# EAGLE design MEB-LV (EAGLE 9.6.2)
Assembly variants: Manufacturing, Customer

## Sheet 1 of 3: Mitochondrik
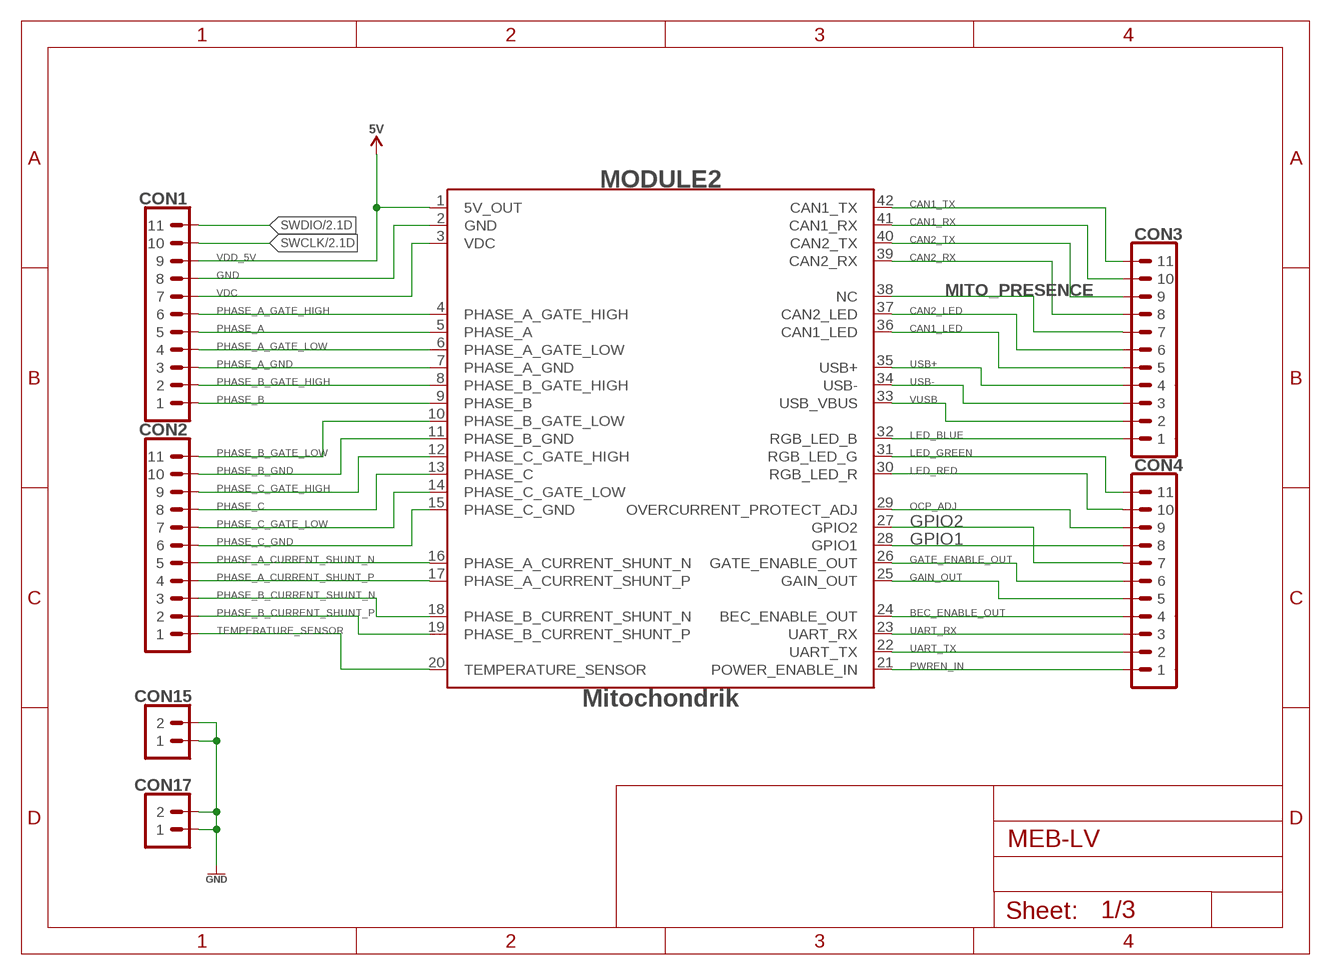
[diagram p0: schematic, sheet 1]

### Parts
CON1  PINHEAD_1X11-2.54_STRAIGHT_MALE  [1X11-PTH-2.54]
CON2  PINHEAD_1X11-2.54_STRAIGHT_MALE  [1X11-PTH-2.54]
CON3  PINHEAD_1X11-2.54_STRAIGHT_MALE  [1X11-PTH-2.54]
CON4  PINHEAD_1X11-2.54_STRAIGHT_MALE  [1X11-PTH-2.54]
CON15  PINHEAD_1X02-2.54  [1X02-PTH-2.54]
CON17  PINHEAD_1X02-2.54  [1X02-PTH-2.54]
MODULE2  MITOCHONDRIK  [MITOCHONDRIK]

### Nets
BEC_ENABLE_OUT: CON4.4 MODULE2.24(BEC_ENABLE_OUT) ; also sheet 2
CAN1_LED: CON3.5 MODULE2.36(CAN1_LED) ; also sheet 2
CAN1_RX: CON3.10 MODULE2.41(CAN1_RX) ; also sheet 2
CAN1_TX: CON3.11 MODULE2.42(CAN1_TX) ; also sheet 2
CAN2_LED: CON3.6 MODULE2.37(CAN2_LED) ; also sheet 2
CAN2_RX: CON3.8 MODULE2.39(CAN2_RX) ; also sheet 2
CAN2_TX: CON3.9 MODULE2.40(CAN2_TX) ; also sheet 2
GAIN_OUT: CON4.5 MODULE2.25(GAIN_OUT) ; also sheet 2
GATE_ENABLE_OUT: CON4.6 MODULE2.26(GATE_ENABLE_OUT) ; also sheet 2
GND: CON1.8 CON15.1 CON15.2 CON17.1 CON17.2 MODULE2.2(GND) ; also sheet 2,3
GPIO1: CON4.8 MODULE2.28(GPIO1) ; also sheet 2
GPIO2: CON4.7 MODULE2.27(GPIO2) ; also sheet 2
LED_BLUE: CON3.1 MODULE2.32(RGB_LED_B) ; also sheet 2
LED_GREEN: CON4.11 MODULE2.31(RGB_LED_G) ; also sheet 2
LED_RED: CON4.10 MODULE2.30(RGB_LED_R) ; also sheet 2
MITO_PRESENCE: CON3.7 MODULE2.38(NC) ; also sheet 3
OCP_ADJ: CON4.9 MODULE2.29(OVERCURRENT_PROTECT_ADJ)
PHASE_A [VDC]: CON1.5 MODULE2.5(PHASE_A) ; also sheet 3
PHASE_A_CURRENT_SHUNT_N: CON2.5 MODULE2.16(PHASE_A_CURRENT_SHUNT_N) ; also sheet 3
PHASE_A_CURRENT_SHUNT_P: CON2.4 MODULE2.17(PHASE_A_CURRENT_SHUNT_P) ; also sheet 3
PHASE_A_GATE_HIGH [VDC]: CON1.6 MODULE2.4(PHASE_A_GATE_HIGH) ; also sheet 3
PHASE_A_GATE_LOW: CON1.4 MODULE2.6(PHASE_A_GATE_LOW) ; also sheet 3
PHASE_A_GND: CON1.3 MODULE2.7(PHASE_A_GND) ; also sheet 3
PHASE_B [VDC]: CON1.1 MODULE2.9(PHASE_B) ; also sheet 3
PHASE_B_CURRENT_SHUNT_N: CON2.3 MODULE2.18(PHASE_B_CURRENT_SHUNT_N) ; also sheet 3
PHASE_B_CURRENT_SHUNT_P: CON2.2 MODULE2.19(PHASE_B_CURRENT_SHUNT_P) ; also sheet 3
PHASE_B_GATE_HIGH [VDC]: CON1.2 MODULE2.8(PHASE_B_GATE_HIGH) ; also sheet 3
PHASE_B_GATE_LOW: CON2.11 MODULE2.10(PHASE_B_GATE_LOW) ; also sheet 3
PHASE_B_GND: CON2.10 MODULE2.11(PHASE_B_GND) ; also sheet 3
PHASE_C: CON2.8 MODULE2.13(PHASE_C) ; also sheet 3
PHASE_C_GATE_HIGH [VDC]: CON2.9 MODULE2.12(PHASE_C_GATE_HIGH) ; also sheet 3
PHASE_C_GATE_LOW: CON2.7 MODULE2.14(PHASE_C_GATE_LOW) ; also sheet 3
PHASE_C_GND: CON2.6 MODULE2.15(PHASE_C_GND) ; also sheet 3
PWREN_IN: CON4.1 MODULE2.21(POWER_ENABLE_IN)
SWCLK: CON1.10 ; also sheet 2
SWDIO: CON1.11 ; also sheet 2
TEMPERATURE_SENSOR: CON2.1 MODULE2.20(TEMPERATURE_SENSOR) ; also sheet 3
UART_RX: CON4.3 MODULE2.23(UART_RX) ; also sheet 2
UART_TX: CON4.2 MODULE2.22(UART_TX) ; also sheet 2
USB+: CON3.4 MODULE2.35(USB+) ; also sheet 2
USB-: CON3.3 MODULE2.34(USB-) ; also sheet 2
VDC [VDC]: CON1.7 MODULE2.3(VDC) ; also sheet 3
VDD_5V: CON1.9 MODULE2.1(5V_OUT) ; supply symbol labelled 5V ; also sheet 2,3
VUSB: CON3.2 MODULE2.33(USB_VBUS) ; also sheet 2

## Sheet 2 of 3: Interfaces
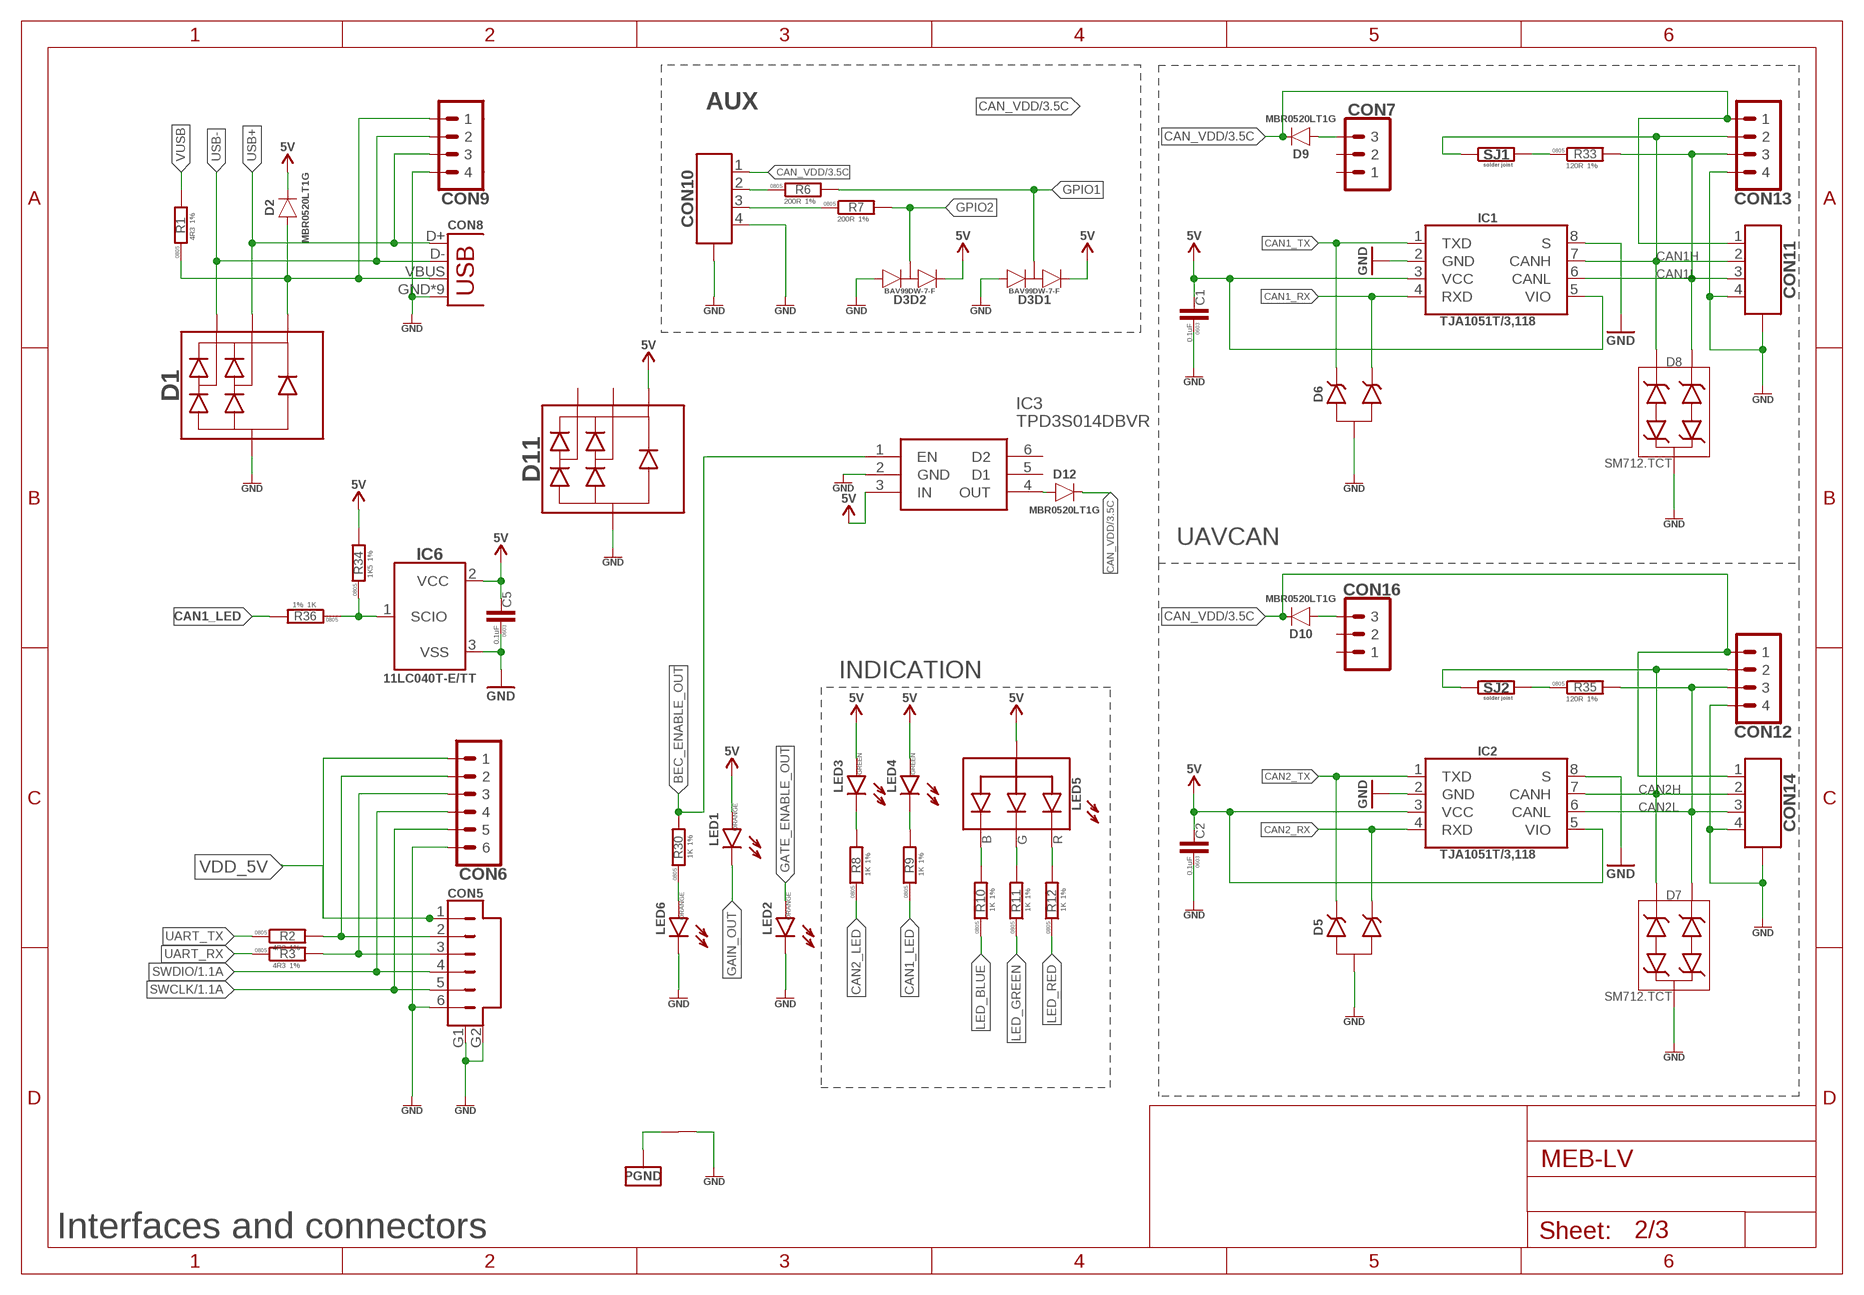
[diagram p1: schematic, sheet 2]

### Parts
C1  0.1uF  C-0603  [C0603]
C2  0.1uF  C-0603  [C0603]
C5  0.1uF  C-0603  [C0603]
CON5  CON-6P-SM06B  [SM06B]
CON6  PINHEAD_1X06-2.54-FEMALE  [1X06-PTH-2.54-FEMALE]
CON7  PINHEAD_1X03-PBS3  [PBS3]
CON8  USB-1  [-10118193-0001LF]  (not fitted in variant Customer)
CON9  PINHEAD_1X04-PBS4  [PBS4]
CON10  CON-4P-TABS-JST_GH-RA  [JST_GH-4P-RA]
CON11  CON-4P-TABS-JST_GH-RA  [JST_GH-4P-RA]
CON12  PINHEAD_1X04-PBS4  [PBS4]
CON13  PINHEAD_1X04-PBS4  [PBS4]
CON14  CON-4P-TABS-JST_GH-RA  [JST_GH-4P-RA]
CON16  PINHEAD_1X03-PBS3  [PBS3]
D1  PRTR5V0U2X  [SOT143B]
D2  MBR0520L-SOD123  [SOD123]
D3  BAV99DW  [SOT363]
D5  ESDA6V1L  [SOT23B-3]
D6  ESDA6V1L  [SOT23B-3]
D7  SM712  [SOT23B-3]
D8  SM712  [SOT23B-3]
D9  MBR0520L-SOD123  [SOD123]
D10  MBR0520L-SOD123  [SOD123]
D11  PRTR5V0U2X  [SOT143B]
D12  MBR0520L-SOD123  [SOD123]  (not fitted in variant Manufacturing)
IC1  TJA1051-SO8  [SOIC8]
IC2  TJA1051-SO8  [SOIC8]
IC3  TPD3S014DBVR  [SOT95P280X145-6N]  (not fitted in variant Manufacturing)
IC6  11LC040T-E/TT  [SOT23B-3]
J1  CONNECTION-SMD  [CONNECTION]
LED1  ORANGE  LED-0603  [LED0603]
LED2  ORANGE  LED-0603  [LED0603]
LED3  GREEN  LED-0603  [LED0603]
LED4  GREEN  LED-0603  [LED0603]
LED5  LTST-C19HE1WT  [0606]
LED6  ORANGE  LED-0603  [LED0603]
R1  4R3  R-1%-0805  [R0805]
R2  4R3  R-1%-0805  [R0805]
R3  4R3  R-1%-0805  [R0805]
R6  200R  R-1%-0805  [R0805]
R7  200R  R-1%-0805  [R0805]
R8  1K  R-1%-0805  [R0805]
R9  1K  R-1%-0805  [R0805]
R10  1K  R-1%-0805  [R0805]
R11  1K  R-1%-0805  [R0805]
R12  1K  R-1%-0805  [R0805]
R30  1K  R-1%-0805  [R0805]
R33  120R  R-1%-0805  [R0805]
R34  1K5  R-1%-0805  [R0805]
R35  120R  R-1%-0805  [R0805]
R36  1K  R-1%-0805  [R0805]
SJ1  SOLDER_JOINT  [RES_0]
SJ2  SOLDER_JOINT  [RES_0]

### Nets
BEC_ENABLE_OUT: IC3.1(EN) R30.2 ; also sheet 1
CAN1_LED: R9.1 R36.2 ; also sheet 1
CAN1_RX: D6.2(C1) IC1.4(RXD) ; also sheet 1
CAN1_TX: D6.1(C) IC1.1(TXD) ; also sheet 1
CAN1H: CON11.2 CON13.2 D8.1(C3) IC1.7(CANH) SJ1.1
CAN1L: CON11.3 CON13.3 D8.2(C2) IC1.6(CANL) R33.2
CAN2_LED: R8.1 ; also sheet 1
CAN2_RX: D5.2(C1) IC2.4(RXD) ; also sheet 1
CAN2_TX: D5.1(C) IC2.1(TXD) ; also sheet 1
CAN2H: CON12.2 CON14.2 D7.1(C3) IC2.7(CANH) SJ2.1
CAN2L: CON12.3 CON14.3 D7.2(C2) IC2.6(CANL) R35.2
CAN_VDD: CON10.1 CON11.1 CON12.1 CON13.1 CON14.1 D9.C D10.C D12.C ; also sheet 3
GAIN_OUT: LED1.C ; also sheet 1
GATE_ENABLE_OUT: LED2.A ; also sheet 1
GND: C1.1 C2.1 C5.1 CON5.6 CON5.G1 CON5.G2 CON6.6 CON8.GND CON8.GND1(GND) CON8.GND2(GND) CON8.GND3(GND) CON8.GND4(GND) CON8.P$1(GND) CON8.P$2(GND) CON8.P$3(GND) CON8.P$4(GND) CON9.4 CON10.4 CON10.M$0(GND) CON10.M$1(GND) CON11.4 CON11.M$0(GND) CON11.M$1(GND) CON12.4 CON13.4 CON14.4 CON14.M$0(GND) CON14.M$1(GND) D1.1(C) D3.1(D1:A) D3.4(D2:A) D5.3(A) D6.3(A) D7.3 D8.3 D11.1(C) IC1.2(GND) IC1.8(S) IC2.2(GND) IC2.8(S) IC3.2(GND) IC6.3(VSS) J1.P$2 LED2.C LED6.C ; also sheet 1,3
GPIO1: D3.6(D1:COMMON) R6.2 ; also sheet 1
GPIO2: D3.3(D2:COMMON) R7.2 ; also sheet 1
LED_BLUE: R10.1 ; also sheet 1
LED_GREEN: R11.1 ; also sheet 1
LED_RED: R12.1 ; also sheet 1
N$8: LED6.A R30.1
N$12: CON7.3 D9.A
N$13: CON16.3 D10.A
N$14: CON5.2 CON6.2 R2.2
N$15: D12.A IC3.4(OUT)
N$16: LED4.C R9.2
N$17: LED3.C R8.2
N$18: R33.1 SJ1.2
N$20: CON10.2 R6.1
N$21: R35.1 SJ2.2
N$24: CON10.3 R7.1
N$58: LED5.R R12.2
N$59: LED5.G R11.2
N$60: LED5.B R10.2
N$76: CON5.3 CON6.3 R3.2
OIUOIUIOU: IC6.1(SCIO) R34.1 R36.1
PGND: J1.P$1 ; also sheet 3
SWCLK: CON5.5 CON6.5 ; also sheet 1
SWDIO: CON5.4 CON6.4 ; also sheet 1
UART_RX: R3.1 ; also sheet 1
UART_TX: R2.1 ; also sheet 1
USB+: CON8.D+ CON9.3 D1.3(D2) ; also sheet 1
USB-: CON8.D- CON9.2 D1.2(D1) ; also sheet 1
USB_VBUS: CON8.VBUS CON9.1 D1.4(A) D2.A R1.1
VDD_5V: C1.2 C2.2 C5.2 CON5.1 CON6.1 D2.C D3.2(D1:C) D3.5(D2:C) D11.4(A) IC1.3(VCC) IC1.5(VIO) IC2.3(VCC) IC2.5(VIO) IC3.3(IN) IC6.2(VCC) LED1.A LED3.A LED4.A LED5.+(A) R34.2 ; supply symbol labelled 5V ; also sheet 1,3
VUSB: R1.2 ; also sheet 1
Unconnected: CON7.1 CON7.2 CON16.1 CON16.2 D11.2(D1) D11.3(D2) IC3.5(D1) IC3.6(D2)

### Notes on the sheet
- AUX
- UAVCAN
- INDICATION
- Interfaces and connectors

## Sheet 3 of 3: Powerstage
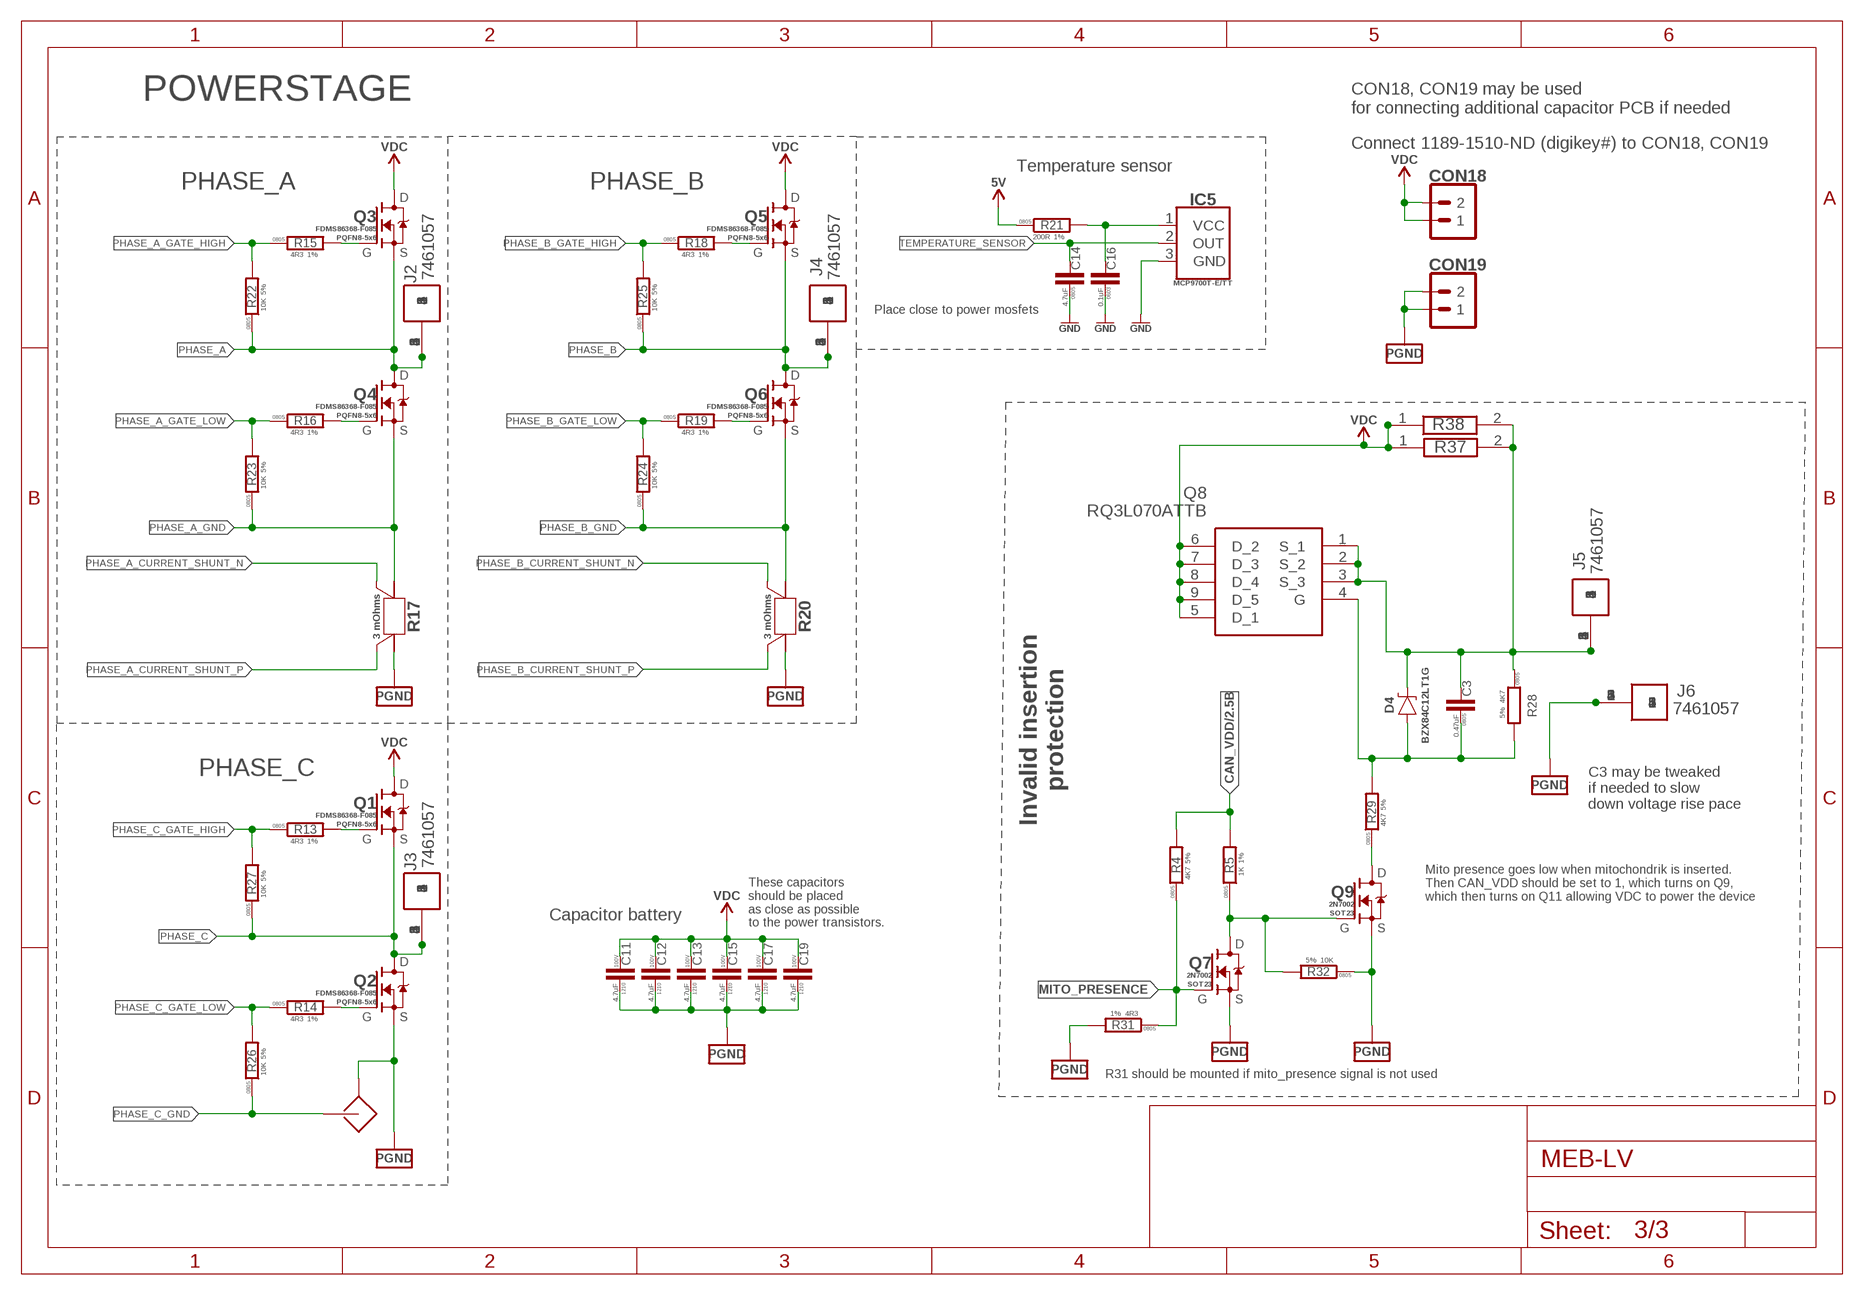
[diagram p2: schematic, sheet 3]

### Parts
C3  0.47uF  C-0805  [C0805]  (not fitted in variant Customer)
C11  4.7uF  C-1210  [C1210]
C12  4.7uF  C-1210  [C1210]
C13  4.7uF  C-1210  [C1210]
C14  4.7uF  C-0805  [C0805]
C15  4.7uF  C-1210  [C1210]
C16  0.1uF  C-0603  [C0603]
C17  4.7uF  C-1210  [C1210]
C19  4.7uF  C-1210  [C1210]
CON18  PINHEAD_1X02-2.54  [1X02-PTH-2.54]
CON19  PINHEAD_1X02-2.54  [1X02-PTH-2.54]
D4  BZX84C12  [SOT23]  (not fitted in variant Customer)
IC5  MCP9700T-E/TT-SOT23  [SOT23B-3]
J2  7461057  [7461057]
J3  7461057  [7461057]
J4  7461057  [7461057]
J5  7461057  [7461057]
J6  7461057  [7461057]
Q1  FDMS86368-F085  [PQFN8_5X6]
Q2  FDMS86368-F085  [PQFN8_5X6]
Q3  FDMS86368-F085  [PQFN8_5X6]
Q4  FDMS86368-F085  [PQFN8_5X6]
Q5  FDMS86368-F085  [PQFN8_5X6]
Q6  FDMS86368-F085  [PQFN8_5X6]
Q7  2N7002  [SOT23]  (not fitted in variant Customer)
Q8  RQ3L070ATTB  [RQ3L070ATTB]  (not fitted in variant Customer)
Q9  2N7002  [SOT23]  (not fitted in variant Customer)
R4  4K7  R-5%-0805  [R0805]  (not fitted in variant Customer)
R5  1K  R-1%-0805  [R0805]  (not fitted in variant Customer)
R13  4R3  R-1%-0805  [R0805]
R14  4R3  R-1%-0805  [R0805]
R15  4R3  R-1%-0805  [R0805]
R16  4R3  R-1%-0805  [R0805]
R17  3 mOhms  CURRENT_SHUNT_KELVIN-0.003R-2512-KELVIN  [R2512-KELVIN]
R18  4R3  R-1%-0805  [R0805]
R19  4R3  R-1%-0805  [R0805]
R20  3 mOhms  CURRENT_SHUNT_KELVIN-0.003R-2512-KELVIN  [R2512-KELVIN]
R21  200R  R-1%-0805  [R0805]
R22  10K  R-5%-0805  [R0805]
R23  10K  R-5%-0805  [R0805]
R24  10K  R-5%-0805  [R0805]
R25  10K  R-5%-0805  [R0805]
R26  10K  R-5%-0805  [R0805]
R27  10K  R-5%-0805  [R0805]
R28  4K7  R-5%-0805  [R0805]  (not fitted in variant Customer)
R29  4K7  R-5%-0805  [R0805]  (not fitted in variant Customer)
R31  4R3  R-1%-0805  [R0805]  (not fitted in variant Customer)  (not fitted in variant Manufacturing)
R32  10K  R-5%-0805  [R0805]  (not fitted in variant Customer)
R37  PMR18EZPJ000  [RESC3216X42N]  (not fitted in variant Manufacturing)
R38  PMR18EZPJ000  [RESC3216X42N]  (not fitted in variant Manufacturing)
S1  SENSE  [SENSE-0.6]

### Nets
CAN_VDD: R4.2 R5.2 ; also sheet 2
GND: C14.1 C16.1 IC5.3(GND) ; also sheet 1,2
MITO_PRESENCE: Q7.1(G) R4.1 R31.1 ; also sheet 1
N$1: C16.2 IC5.1(VCC) R21.2
N$2 [VDC]: Q5.4(G) R18.2
N$3: Q6.4(G) R19.2
N$5: Q7.3(D) Q9.1(G) R5.1 R32.2
N$6 [VDC]: Q3.4(G) R15.2
N$7: Q4.4(G) R16.2
N$9: Q9.3(D) R29.1
N$10 [VDC]: Q1.4(G) R13.2
N$11: Q2.4(G) R14.2
N$22: C3.2 D4.3(C) J5.1 J5.2 J5.3 J5.4 J5.5 J5.6 Q8.1(S_1) Q8.2(S_2) Q8.3(S_3) R28.1 R37.2 R38.2
PGND: C11.1 C12.1 C13.1 C15.1 C17.1 C19.1 CON19.1 CON19.2 J6.1 J6.2 J6.3 J6.4 J6.5 J6.6 Q2.1(S) Q2.2(S) Q2.3(S) Q7.2(S) Q9.2(S) R17.2 R17.22 R20.2 R20.22 R31.2 R32.1 S1.SHELL(SHELLL) ; also sheet 2
PHASE_A [VDC]: J2.1 J2.2 J2.3 J2.4 J2.5 J2.6 Q3.1(S) Q3.2(S) Q3.3(S) Q4.5(D) Q4.6(D) Q4.7(D) Q4.8(D) Q4.P$1(D) R22.1 ; also sheet 1
PHASE_A_CURRENT_SHUNT_N: R17.S1 ; also sheet 1
PHASE_A_CURRENT_SHUNT_P: R17.S2 ; also sheet 1
PHASE_A_GATE_HIGH [VDC]: R15.1 R22.2 ; also sheet 1
PHASE_A_GATE_LOW: R16.1 R23.2 ; also sheet 1
PHASE_A_GND: Q4.1(S) Q4.2(S) Q4.3(S) R17.1 R17.11 R23.1 ; also sheet 1
PHASE_B [VDC]: J4.1 J4.2 J4.3 J4.4 J4.5 J4.6 Q5.1(S) Q5.2(S) Q5.3(S) Q6.5(D) Q6.6(D) Q6.7(D) Q6.8(D) Q6.P$1(D) R25.1 ; also sheet 1
PHASE_B_CURRENT_SHUNT_N: R20.S1 ; also sheet 1
PHASE_B_CURRENT_SHUNT_P: R20.S2 ; also sheet 1
PHASE_B_GATE_HIGH [VDC]: R18.1 R25.2 ; also sheet 1
PHASE_B_GATE_LOW: R19.1 R24.2 ; also sheet 1
PHASE_B_GND: Q6.1(S) Q6.2(S) Q6.3(S) R20.1 R20.11 R24.1 ; also sheet 1
PHASE_C: J3.1 J3.2 J3.3 J3.4 J3.5 J3.6 Q1.1(S) Q1.2(S) Q1.3(S) Q2.5(D) Q2.6(D) Q2.7(D) Q2.8(D) Q2.P$1(D) R27.1 ; also sheet 1
PHASE_C_GATE_HIGH [VDC]: R13.1 R27.2 ; also sheet 1
PHASE_C_GATE_LOW: R14.1 R26.2 ; also sheet 1
PHASE_C_GND: R26.1 S1.IN ; also sheet 1
SFGKDLS: C3.1 D4.1(A) Q8.4(G) R28.2 R29.2
TEMPERATURE_SENSOR: C14.2 IC5.2(OUT) ; also sheet 1
VDC [VDC]: C11.2 C12.2 C13.2 C15.2 C17.2 C19.2 CON18.1 CON18.2 Q1.5(D) Q1.6(D) Q1.7(D) Q1.8(D) Q1.P$1(D) Q3.5(D) Q3.6(D) Q3.7(D) Q3.8(D) Q3.P$1(D) Q5.5(D) Q5.6(D) Q5.7(D) Q5.8(D) Q5.P$1(D) Q8.5(D_1) Q8.6(D_2) Q8.7(D_3) Q8.8(D_4) Q8.9(D_5) R37.1 R38.1 ; also sheet 1
VDD_5V: R21.1 ; supply symbol labelled 5V ; also sheet 1,2

### Notes on the sheet
- POWERSTAGE
- CON18, CON19 may be used 
  for connecting additional capacitor PCB if needed
- Connect 1189-1510-ND (digikey#) to CON18, CON19
- Temperature sensor
- PHASE_A | PHASE_B
- Place close to power mosfets
- Invalid insertion
  protection
- PHASE_C
- C3 may be tweaked
  if needed to slow 
  down voltage rise pace
- Mito presence goes low when mitochondrik is inserted.
  Then CAN_VDD should be set to 1, which turns on Q9,
  which then turns on Q11 allowing VDC to power the device
- Capacitor battery
- These capacitors
  should be placed 
  as close as possible 
  to the power transistors.
- R31 should be mounted if mito_presence signal is not used

## Library data of the parts
C1 C2 C5 C16 = rc:C; DIGIKEY#: 1276-1938-1-ND; MANF: Samsung Electro-Mechanics; MANF#: CL10B104KO8NFNC; PACKAGE: 0603
C3 = rc:C; MANF: TAIYO YUDEN; MANF#: HMK212C7474KGHTE; PACKAGE: 0805
C11-C13 C15 C17 C19 = rc:C; AEC-Q: AEC-Q200; DIGIKEY#: 490-14484-1-ND; MANF: Murata Electronics; MANF#: GCM32DC72A475KE02L; OPERATING_TEMP: -55°C ~ 125°C; PACKAGE: 1210; VOLTAGE: 100V
C14 = rc:C; DIGIKEY#: 1276-2415-1-ND; PACKAGE: 0805
CON1-CON4 = pinhead:PINHEAD_1X11; DIGIKEY#: S1022EC-11-ND; MANF: Sullins Connector Solutions; MANF#: PREC011SABN-RC
CON5 = Connectors:CON-6P: CONN HEADER 6 POS; DIGIKEY#: 455-1806-1-ND; MANF: JST Sales America Inc; MANF#: SM06B-SRSS-TB(LF)(SN)
CON6 = pinhead:PINHEAD_1X06: pinheader 6P
CON7 CON16 = pinhead:PINHEAD_1X03: pinheader 3P
CON8 = Connectors:USB: Connector Receptacle USB - micro B 2.0 5 Position; DIGIKEY#: 609-4616-1-ND; MANF: FCI; MANF#: 10118193-0001LF
CON9 CON12 CON13 = pinhead:PINHEAD_1X04
CON10 CON11 CON14 = Connectors:CON-4P-TABS: Connector Receptacle 4 Position 0.049" (1.25mm) Tin Surface Mount; DIGIKEY#: 455-1566-1-ND; LCSC#: C189895; MANF: JST Sales America Inc; MANF#: SM04B-GHS-TB(LF)(SN)
CON15 CON17 = pinhead:PINHEAD_1X02: pinheader 2P; DIGIKEY#: S1041E-02-ND; MANF: Sullins Connector Solutions; MANF#: PBC02SADN
CON18 CON19 = pinhead:PINHEAD_1X02: pinheader 2P
D1 D11 = TVS_diodes:PRTR5V0U2X: DIODES - ESD SOT-143; DIGIKEY#: 568-4140-2-ND; LCSC#: C12333; MANF: NXP USA Inc; MANF#: PRTR5V0U2X,215
D2 D9 D10 D12 = Diodes:MBR0520L: DIODE SCHOTTKY 20V 500MA SOD123; DIGIKEY#: MBR0520LT1GOSTR-ND; LCSC#: C23848; MANF: ON Semiconductor; MANF#: MBR0520LT1G
D3 = Diodes:BAV99DW: DIODE ARRAY GP 75V 215MA SOT363; DIGIKEY#: BAV99DW-FDICT-ND; LCSC#: C150465; MANF: Diodes Incorporated; MANF#: BAV99DW-7-F
D4 = Diodes:BZX84C: Zener Diode 250mW ±5% Surface Mount SOT-23-3 (TO-236); DIGIKEY#: BZX84C12LT1GOSTR-ND; LCSC#: C82475; MANF: ON Semiconductor; MANF#: BZX84C12LT1G
D5 D6 = TVS_diodes:ESDA6V1L: TVS DIODE 5.25VWM SOT23; DIGIKEY#: 497-2930-2-ND; LCSC#: C24378; MANF: STMicroelectronics; MANF#: ESDA6V1L
D7 D8 = TVS_diodes:SM712: TVS DIODE 12VWM/7VWM SOT23; DIGIKEY#: SM712-TPMSCT-ND; LCSC#: C12067; MANF: Semtech Corporation; MANF#: SM712.TCT
IC1 IC2 = serial_interfaces:TJA1051: 1/1 Transceiver Half CAN; DIGIKEY#: 568-8684-2-ND; LCSC#: C38695; MANF: NXP USA Inc; MANF#: TJA1051T/3,118
IC3 = TPD3S014DBVR:TPD3S014DBVR: Current Limit Load Sw & TVS 0.5A SOT23-6 Texas Instruments TPD3S014DBVR Load Switch IC, Current Limit Switch, 4.5 5.5V, 6-Pin, SOT-23 Source: Datasheet <http://www.ti.com/lit/ds/symlink/tpd3s044.pdf>; DESCRIPTION: Current Limit Load Sw & TVS 0.5A SOT23-6 Texas Instruments TPD3S014DBVR Load Switch IC, Current Limit Switch, 4.5 5.5V, 6-Pin, SOT-23; HEIGHT: 1.45mm; MANUFACTURER_NAME: Texas Instruments; MANUFACTURER_PART_NUMBER: TPD3S014DBVR; MOUSER_PART_NUMBER: 595-TPD3S014DBVR; MOUSER_PRICE-STOCK: https://www.mouser.co.uk/ProductDetail/Texas-Instruments/TPD3S014DBVR?qs=1CfNGUMoiQ%252BDmiZShdlX0g%3D%3D
IC5 = misc:MCP9700: Temperature Sensor Analog, Local -40°C ~ 125°C 10mV/°C; AEC-Q: ---; DIGIKEY#: MCP9700T-E/TTTR-ND; MANF: Microchip Technology; MANF#: MCP9700T-E/TT
IC6 = misc:11LC040T-E/TT: EEPROM Memory IC 4Kb (512 x 8) Single Wire 100kHz SOT-23-3; AEC-Q: ---; DIGIKEY#: 11LC040T-E/TTCT-ND; MANF: Microchip Technology; MANF#: 11LC040T-E/TT; OPERATING_TEMP: -40°C ~ 125°C (TA)
J1 = misc:CONNECTION; BOM: EXCLUDE
J2-J6 = 7461057:7461057: PCB power element bush terminal, 6P, M3 Source: Datasheet <https://katalog.we-online.com/em/datasheet/7461057.pdf>; DESCRIPTION: PCB power element bush terminal, 6P, M3; HEIGHT: 6.2mm; MANF: Wurth Elektronik; MANF#: 7461057; MOUSER_PART_NUMBER: 710-7461057; MOUSER_PRICE-STOCK: https://www.mouser.co.uk/ProductDetail/Wurth-Elektronik/7461057?qs=lykWx4dhCCH1DoqS0WFLUA%3D%3D
LED1 LED2 LED6 = rc:LED: SMD LED; COLOR: ORANGE; DIGIKEY#: 754-1120-1-ND; LCSC#: C375450; MANF: Kingbright; MANF#: APT1608SECK
LED3 LED4 = rc:LED: SMD LED; COLOR: GREEN; DIGIKEY#: 754-1116-1-ND; LCSC#: C72043; MANF: Kingbright; MANF#: APT1608CGCK
LED5 = misc:LTST-C19HE1WT: LED RGB DIFFUSED CHIP SMD; DIGIKEY#: 160-2162-1-ND; MANF: Lite-On Inc; MANF#: LTST-C19HE1WT
MODULE2 = mitochondrik:MITOCHONDRIK; MANF: Zubax Robotics; MANF#: Mitochondrik
Q1-Q6 = mosfet:FDMS86368-F085: N-Channel 80V 80A (Tc) 214W (Tc) Surface Mount Power56; AEC-Q: AEC-Q101; ALTERNATIVE: BSC080N12LSGATMA1; DIGIKEY#: FDMS86368-F085CT-ND; MANF: ON Semiconductor; MANF#: FDMS86368-F085; OPERATING_TEMP: -55°C ~ 175°C (TJ); PACKAGE: PQFN8-5x6
Q7 Q9 = mosfet:2N7002: N-Channel 60V 115mA 2.5V @ 250uA 7.5Ω @ 500mA,10V 200mW SOT-23(SOT-23-3) MOSFET RoHS; DIGIKEY#: 2N7002NCT-ND; LCSC#: C8545; MANF: Changjiang Electronics Tech (CJ); MANF#: 2N7002; PACKAGE: SOT23
Q8 = RQ3L070ATTB:RQ3L070ATTB: P-Channel 60 V 25A (Tc) 2W (Ta) Surface Mount 8-HSMT (3.2x3) Source: Datasheet <https://fscdn.rohm.com/en/products/databook/datasheet/discrete/transistor/mosfet/rq3l070attb-e.pdf>; DESCRIPTION: P-Channel 60 V 25A (Tc) 2W (Ta) Surface Mount 8-HSMT (3.2x3); MANF: ROHM Semiconductor; MANF#: RQ3L070ATTB
R1 = rc:R; PACKAGE: 0805; TOLERANCE: 1%
R2 R3 R13-R16 R18 R19 R31 = rc:R; DIGIKEY#: 311-4.3ARTR-ND; MANF: Yageo; MANF#: RC0805JR-074R3L; PACKAGE: 0805; TOLERANCE: 1%
R4 R28 R29 = rc:R; DIGIKEY#: YAG3364CT-ND; MANF: Yageo; MANF#: RT0805FRE074K7L; PACKAGE: 0805; TOLERANCE: 5%
R5 R8-R12 R30 R36 = rc:R; AEC-Q: ---; DIGIKEY#: YAG1240CT-ND; MANF: Yageo; MANF#: RT0805FRE071KL; OPERATING_TEMP: -55°C ~ 155°C; PACKAGE: 0805; TOLERANCE: 1%
R6 R7 = rc:R; MANF: Panasonic; MANF#: ERJ-6ENF2000V; PACKAGE: 0805; TOLERANCE: 1%
R17 R20 = SHUNT_RESISTORS:CURRENT_SHUNT_KELVIN; DIGIKEY#: CSNL2512FT3L00CT-ND; LCSC#: C76247; MANF: Stackpole Electronics Inc.; MANF#: CSNL2512FT3L00; POWER: 2W; TC: ±50ppm/°C; TOLERANCE: ±1%
R21 = rc:R; DIGIKEY#: 13-RT0805FRE07200RLCT-ND; MANF: Yageo; MANF#: RT0805FRE07200RL; PACKAGE: 0805; TOLERANCE: 1%
R22-R27 R32 = rc:R; DIGIKEY#: YAG1239CT-ND; MANF: Yageo; MANF#: RT0805FRE0710KL; PACKAGE: 0805; TOLERANCE: 5%
R33 R35 = rc:R; AEC-Q: ---; DIGIKEY#: 311-120CRCT-ND; MANF: Yageo; MANF#: RC0805FR-07120RL; OPERATING_TEMP: -55°C ~ 155°C; PACKAGE: 0805; TOLERANCE: 1%
R34 = rc:R; MANF: YAGEO; MANF#: RT0805FRE071K5L; PACKAGE: 0805; TOLERANCE: 1%
R37 R38 = PMR18EZPJ000:PMR18EZPJ000: Current Sense Resistors - SMD 1206 0ohm Jumper 5% CS Mtl Strp AEC-Q200 Source: Datasheet <https://fscdn.rohm.com/en/products/databook/datasheet/passive/resistor/chip_resistor/pmr-jpw-e.pdf>; DESCRIPTION: Current Sense Resistors - SMD 1206 0ohm Jumper 5% CS Mtl Strp AEC-Q200; HEIGHT: 0.42mm; MANF: ROHM Semiconductor; MANF#: PMR18EZPJ000; MANUFACTURER_NAME: ROHM Semiconductor; MANUFACTURER_PART_NUMBER: PMR18EZPJ000; MOUSER_PART_NUMBER: 755-PMR18EZPJ000; MOUSER_PRICE-STOCK: https://www.mouser.co.uk/ProductDetail/ROHM-Semiconductor/PMR18EZPJ000?qs=F3nc1lPKfV7xjhm%252BR6Umvg%3D%3D; PACKAGE: 1206
S1 = misc:SENSE; BOM: EXCLUDE
SJ1 SJ2 = misc:SOLDER_JOINT

## Net classes
1 VDC: width 0.3 mm, clearance 0.3 mm
2 5V: width 0.5 mm

## Board
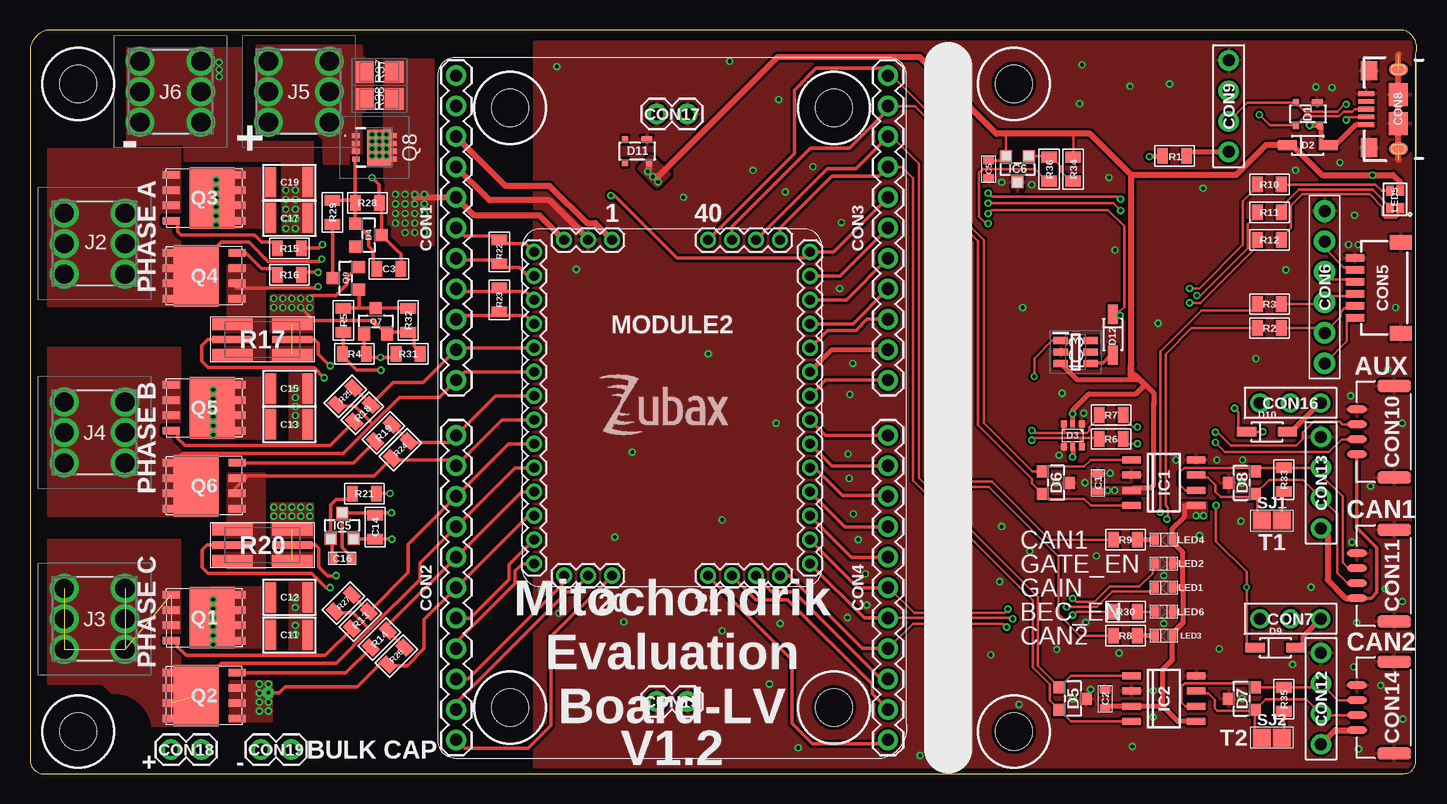
[diagram p3: board, top side]
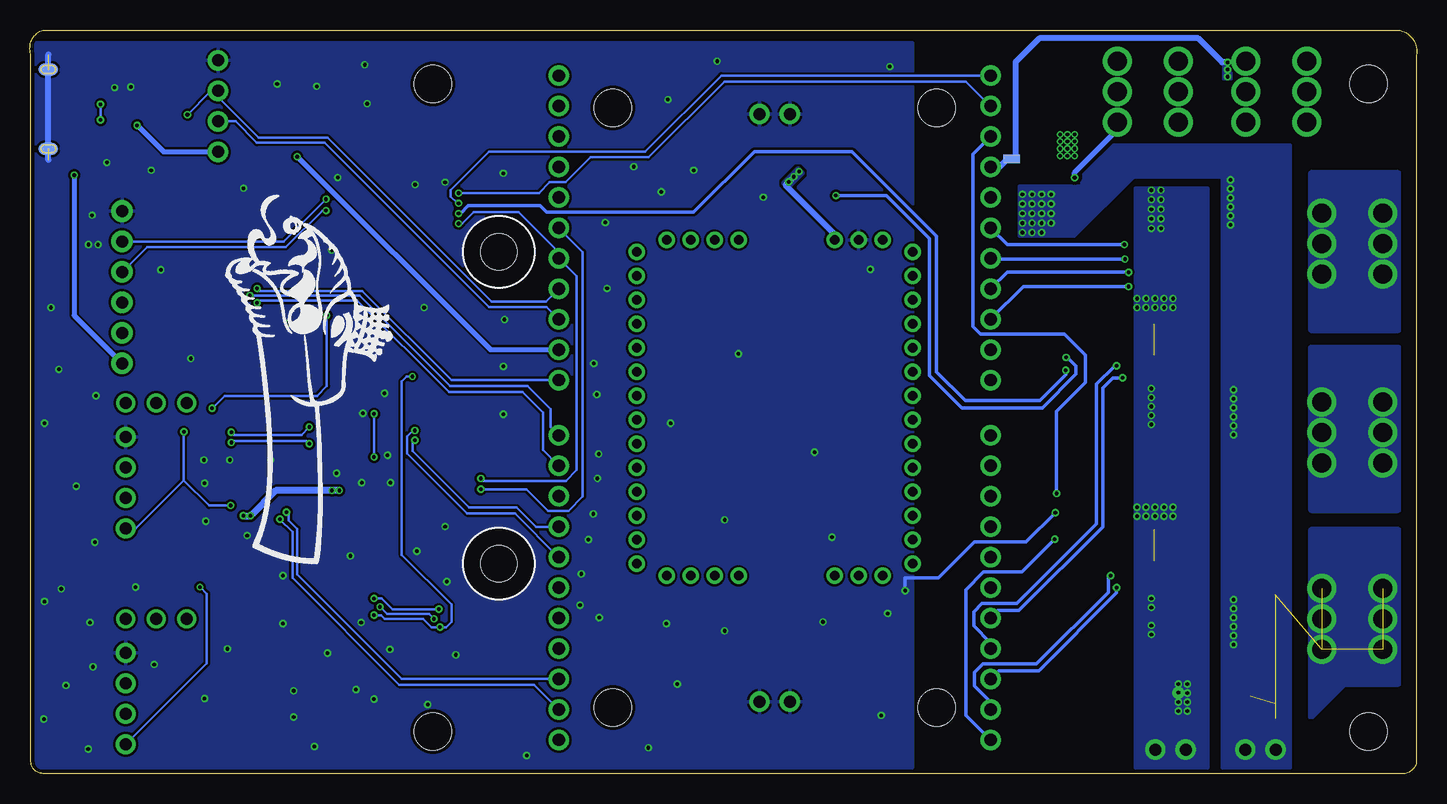
[diagram p4: board, bottom side, seen from below]

Size 115.6 x 62.04 mm. Coordinates in mm from the lower left corner, seen from the top.
Outline: 0.02,59.94 0.02,0.94 arc90 1.52,0.04 114.52,0.04 arc90 115.52,1.04 115.52,60.04 arc90 114.52,62.04 1.52,62.04 arc90 0.02,59.94
Copper layers (1*16): Top 0.035mm / dielectric 1.5mm / Bottom 0.035mm
Design rules "myxa *": minimum track width 0.15mm, minimum drill 0.2mm, track to track 0.2mm, track to pad 0.2mm, pad to pad 0.2mm, via to via 0.2mm, smd to smd 0.15mm, copper to edge 0.3mm, drill to drill 0.2mm, minimum pad ring 0.125mm, minimum via ring 0.125mm, stop-mask expansion 1mil, vias tented up to drill 0.51mm, thermal gap 8mil
Holes 3.1 mm at 40.02,5.54 67.02,5.54 40.02,55.54 67.02,55.54 82.02,3.54 4.02,3.54 82.02,57.54 4.02,57.54
Holes 3 mm at 76.52,17.54 76.52,43.54
tRestrict: area 4,0.5 to 10,6.5
bRestrict: area 73.5,40.5 to 79.5,46.5; area 73.5,14.5 to 79.5,20.5

### Footprints (pad centres in the part's own frame; a part is rotated, then mirrored left to right if it is on the bottom)
C0603 = smd 0.6 x 0.9: 1 -0.725,0; 2 0.725,0
C0805 = smd 0.9 x 1.3: 1 -1,0; 2 1,0
C1210 = smd 0.9 x 2.5: 1 -1.55,0; 2 1.55,0
1X11-PTH-2.54 = drill 1.016 pad 1.7: 1 -12.7,0; 2 -10.16,0; 3 -7.62,0; 4 -5.08,0; 5 -2.54,0; 6 0,0; 7 2.54,0; 8 5.08,0; 9 7.62,0; 10 10.16,0; 11 12.7,0
SM06B = smd 0.6 x 1.55: 1 -2.5,2.275; 2 -1.5,2.275; 3 -0.5,2.275; 4 0.5,2.275; 5 1.5,2.275; 6 2.5,2.275 | smd 1.2 x 1.8: G1 -3.8,-1.55; G2 3.8,-1.55
1X06-PTH-2.54-FEMALE = drill 1 pad 1.8: 1 -6.35,0; 2 -3.81,0; 3 -1.27,0; 4 1.27,0; 5 3.81,0; 6 6.35,0
PBS3 = drill 1 pad 1.6: 1 -2.54,0; 2 0,0; 3 2.54,0
-10118193-0001LF = smd 0.4 x 1.35: D+ 0,2.68; D- -0.65,2.68; GND 1.3,2.68; ID 0.65,2.68; VBUS -1.3,2.68 | smd 1.9 x 1.6: GND1 -1.2,0; GND2 1.2,0 | smd 1.6 x 1.4: GND3 -3.2,2.45; GND4 3.2,2.45 | smd 1 x 1.6: P$1 -3.3,0; P$2 3.3,0 | smd 1 x 1.6 bottom: P$3 -3.3,0; P$4 3.3,0
PBS4 = drill 1 pad 1.7: 1 -3.81,0; 2 -1.27,0; 3 1.27,0; 4 3.81,0
JST_GH-4P-RA = smd 0.6 x 1.7: 1 1.875,-2.91; 2 0.625,-2.91; 3 -0.625,-2.91; 4 -1.875,-2.91 | smd 1 x 2.8: M$0 -3.825,0.19; M$1 3.825,0.19
1X02-PTH-2.54 = drill 1 pad 1.7: 1 -1.27,0; 2 1.27,0
SOT143B = smd 0.6 x 0.9: 1 -0.95,0.8 | smd 0.6 x 0.5: 2 -0.95,-1; 3 0.95,-1; 4 0.95,1
SOD123 = smd 1.6 x 0.8: A -1.7,0; C 1.7,0
SOT363 = smd 0.6 x 0.5: 1 -0.95,0.75; 3 -0.95,-0.75; 4 0.95,-0.75; 6 0.95,0.75 | smd 0.6 x 0.4: 2 -0.95,0; 5 0.95,0
SOT23 = smd 1 x 1: 1 1.1,-0.95; 2 1.1,0.95; 3 -1.1,0
SOT23B-3 = smd 1 x 1: 1 -0.95,-1.1; 2 0.95,-1.1; 3 0,1.1
SOIC8 = smd 1.55 x 0.6: 1 -2.7,1.905; 2 -2.7,0.635; 3 -2.7,-0.635; 4 -2.7,-1.905; 5 2.7,-1.905; 6 2.7,-0.635; 7 2.7,0.635; 8 2.7,1.905
SOT95P280X145-6N = smd 1.2 x 0.6: 1 -1.25,0.95; 2 -1.25,0; 3 -1.25,-0.95; 4 1.25,-0.95; 5 1.25,0; 6 1.25,0.95
CONNECTION = smd 0.7 x 0.7: P$1 -0.35,0; P$2 0.35,0
7461057 = drill 1.6 pad 2.3: 1 0,0; 2 0,-2.54; 3 0,-5.08; 4 5.08,-5.08; 5 5.08,-2.54; 6 5.08,0
LED0603 = smd 0.6 x 0.9: A 0.725,0; C -0.725,0
0606 = smd 0.65 x 0.85: + -0.425,-0.725; B 0.425,-0.725; G 0.425,0.725; R -0.425,0.725
MITOCHONDRIK = drill 0.8 pad 1.35: 1 -5,14; 2 -7,14; 3 -9,14; 4 -11.5,13; 5 -11.5,11; 6 -11.5,9; 7 -11.5,7; 8 -11.5,5; 9 -11.5,3; 10 -11.5,1; 11 -11.5,-1; 12 -11.5,-3; 13 -11.5,-5; 14 -11.5,-7; 15 -11.5,-9; 16 -11.5,-11; 17 -11.5,-13; 18 -9,-14; 19 -7,-14; 20 -5,-14; 21 3,-14; 22 5,-14; 23 7,-14; 24 9,-14; 25 11.5,-13; 26 11.5,-11; 27 11.5,-9; 28 11.5,-7; 29 11.5,-5; 30 11.5,-3; 31 11.5,-1; 32 11.5,1; 33 11.5,3; 34 11.5,5; 35 11.5,7; 36 11.5,9; 37 11.5,11; 38 11.5,13; 39 9,14; 40 7,14; 41 5,14; 42 3,14
PQFN8_5X6 = smd 1.42 x 0.61: 1 -2.75,1.905; 2 -2.75,0.635; 3 -2.75,-0.635; 4 -2.75,-1.905; 5 2.74,-1.905; 6 2.74,-0.635; 7 2.74,0.635; 8 2.74,1.905 | smd 3.75 x 5.1: P$1 0.65,0
RQ3L070ATTB = smd 0.43 x 0.6: 1 -0.975,-1.55; 2 -0.325,-1.55; 3 0.325,-1.55; 4 0.975,-1.55 | smd 0.43 x 0.45: 5 0.975,1.625; 6 0.325,1.625; 7 -0.325,1.625; 8 -0.975,1.625 | smd 3 x 2: 9 0,0.4
R0805 = smd 0.9 x 1.3: 1 -1,0; 2 1,0
R2512-KELVIN = smd 3.4 x 1: 1 -2.5,1.3; 2 2.5,1.3; 11 -2.5,-1.3; 22 2.5,-1.3 | smd 3.4 x 0.6: S1 -2.5,0; S2 2.5,0
RESC3216X42N = smd 1.55 x 1.8: 1 -1.25,0; 2 1.25,0
SENSE-0.6 = smd 0.1 x 0.1: IN 0,0 | drill 0.3 pad 0.6: SHELL 0,0
RES_0 = smd 1.5 x 1.5: 1 -0.85,0; 2 0.85,0

### Placement (x,y rotation side)
C1  89.02,24.29 270 top
C2  89.62,6.29 270 top
C3  29.92,42.14 0 top
C5  79.92,50.44 90 top
C11  21.62,11.59 180 top
C12  21.62,14.74 180 top
C13  21.62,29.14 180 top
C14  28.77,20.59 270 top
C15  21.62,32.14 180 top
C16  26.02,17.99 180 top
C17  21.62,46.34 180 top
C19  21.62,49.34 180 top
CON1  35.52,45.54 90 top
CON2  35.52,15.54 90 top
CON3  71.52,45.54 90 top
CON4  71.52,15.54 90 top
CON5  112.72,40.54 90 top
CON6  107.92,40.59 90 top
CON7  105.07,12.94 0 top
CON8  114.07,55.44 90 top
CON9  99.92,55.69 90 top
CON10  113.52,28.54 270 top
CON11  113.52,16.54 270 top
CON12  107.62,6.29 90 top
CON13  107.62,24.29 90 top
CON14  113.52,5.54 270 top
CON15  53.52,6.04 0 top
CON16  105.07,30.94 0 top
CON17  53.52,55.04 0 top
CON18  13.02,2.04 0 top
CON19  20.52,2.04 0 top
D1  106.52,55.04 270 top
D2  106.52,52.44 180 top
D3  86.92,28.24 270 top
D4  28.22,44.94 180 top
D5  86.92,6.29 270 top
D6  85.52,24.29 270 top
D7  101.02,6.29 90 top
D8  101.02,24.29 90 top
D9  103.82,10.54 180 top
D10  103.12,28.54 180 top
D11  50.62,51.94 270 top
D12  90.27,36.64 90 top
IC1  94.52,24.29 0 top
IC2  94.52,6.29 0 top
IC3  87.17,35.19 0 top
IC5  26.02,20.69 0 top
IC6  82.32,50.44 180 top
J1  33.77,51.29 180 bottom
J2  7.92,41.69 180 top
J3  7.92,10.39 180 top
J4  7.92,25.94 180 top
J5  19.87,59.44 0 top
J6  9.17,59.44 0 top
LED1  94.52,15.54 0 top
LED2  94.52,17.54 180 top
LED3  94.52,11.54 0 top
LED4  94.52,19.54 0 top
LED5  113.8,47.91 180 top
LED6  94.52,13.54 180 top
MODULE2  53.52,30.54 0 top
Q1  14.52,13.04 0 top
Q2  14.52,6.54 180 top
Q3  14.52,48.04 0 top
Q4  14.52,41.54 180 top
Q5  14.52,30.54 0 top
Q6  14.52,24.04 180 top
Q7  28.82,37.74 270 top
Q8  28.72,52.24 270 top
Q9  26.32,41.34 0 top
R1  95.42,51.54 180 top
R2  103.32,37.19 0 top
R3  103.32,39.19 0 top
R4  27.05,35.04 180 top
R5  26.12,37.84 270 top
R6  90.12,27.94 180 top
R7  90.12,29.94 180 top
R8  91.32,11.54 0 top
R9  91.32,19.54 0 top
R10  103.32,49.16 0 top
R11  103.32,46.84 0 top
R12  103.32,44.54 0 top
R13  27.55,12.82 225 top
R14  29.12,11.24 225 top
R15  21.62,43.84 180 top
R16  21.62,41.64 180 top
R17  19.37,36.24 0 top
R18  27.72,30.09 225 top
R19  29.47,28.44 225 top
R20  19.37,19.09 0 top
R21  27.87,23.39 180 top
R22  39.12,43.54 90 top
R23  39.12,39.54 90 top
R24  30.87,27.04 45 top
R25  26.27,31.49 45 top
R26  30.52,9.84 45 top
R27  26.12,14.24 45 top
R28  28.12,47.64 180 top
R29  25.22,46.84 90 top
R30  91.32,13.54 180 top
R31  31.52,35.04 0 top
R32  31.52,37.84 90 top
R33  104.52,24.54 90 top
R34  86.97,50.44 90 top
R35  104.52,6.24 90 top
R36  84.97,50.44 270 top
R37  29.12,58.54 180 top
R38  29.12,56.29 180 top
S1  19.87,6.79 0 top
SJ1  103.52,21.14 0 top
SJ2  103.52,3.04 0 top
U$1  [DRAGON-30X13]  99.37,48.29 270 bottom
U$2  [ZUBAX_LOGO_5X10]  47.32,28.09 0 top
U$3  [BABEL-BABEL]  74.52,30.54 0 top

### Tracks (layer width: path | path; a pad name or v marks a point on that pad's centre or on a via)
BEC_ENABLE_OUT  (via drill 0.3, 0.3 pad 0.6)
  Top 0.2: CON4.4 73.6,12.54 81.12,12.54 v81.42,12.24 | v86.92,13.24 87.22,13.54 R30.2 | IC3.1 85.2,36.14 83.72,34.66 v83.72,33.14
  Top 0.3: CON4.4 69.4,10.46 63.32,16.54 MODULE2.24
  Bottom 0.2: v86.92,13.24 86.32,13.24 86.02,12.94 82.82,12.94 82.12,12.24 v81.42,12.24 80.93,12.24 80.47,12.69 80.47,14.14 84.62,18.29 84.62,32.74 84.22,33.14 v83.72,33.14 83.72,33.19
CAN1_LED  (via drill 0.3 pad 0.6)
  Top 0.2: R9.1 85.02,19.54 80.17,24.39 78.27,24.39 v78.02,24.64 | R36.2 84.77,49.44 83.77,50.44 79.42,50.44 79.12,50.14 79.12,46.49 79.72,45.89 v79.87,45.89
  Top 0.3: CON3.5 68.06,39.54 MODULE2.36
  Bottom 0.2: v78.02,24.64 77.82,24.44 70.92,24.44 70.02,25.34 70.02,41.5 CON3.5 71.52,43.5 74.86,46.84 78.62,46.84 79.57,45.89 v79.87,45.89
CAN1_RX
  Top 0.2: IC1.4 88.43,22.38 87.87,22.94 84.47,22.94 84.42,22.99 D6.2 83.52,24.24 83.52,24.59 79.02,29.09 79.02,44.44 77.42,46.04 77.42,52.04 73.76,55.7 CON3.10
  Top 0.3: CON3.10 71.52,55.39 68.32,52.19 65.07,52.19 58.52,45.64 MODULE2.41
CAN1_TX
  Top 0.2: IC1.1 88.43,26.19 87.87,25.64 84.82,25.64 D6.1 83.57,25.24 79.52,29.29 79.52,44.54 77.82,46.24 77.82,52.26 71.85,58.24 CON3.11
  Top 0.3: CON3.11 70.92,58.84 65.52,58.84 63.72,57.04 63.72,51.74 MODULE2.42
CAN1H
  Top 0.2: 102.32,23.14 102.37,23.09 99.27,23.09 98.82,23.54 98.82,24.09 98.19,24.72 97.42,24.72 IC1.7 | 102.32,23.14 D8.1 103.32,24.54 106.1,24.54 CON13.2 108.97,21.67 108.97,16.79 109.85,15.91 CON11.2 | SJ1.1 102.32,21.49 102.32,23.14
CAN1L
  Top 0.2: IC1.6 96.31,23.65 95.87,24.09 95.87,25.2 96.22,25.54 101.82,25.54 D8.2 102.42,25.54 R33.2 107.6,25.54 CON13.3 107.62,24.94 109.42,23.14 109.42,17.64 109.9,17.16 CON11.3
CAN2_LED  (via drill 0.3 pad 0.6)
  Top 0.2: R8.1 87.52,11.54 85.72,13.34 85.72,18.14 79.92,23.94 78.22,23.94 v78.02,23.74
  Top 0.3: CON3.6 67.52,41.54 MODULE2.37
  Bottom 0.2: CON3.6 69.52,43.54 69.52,23.14 70.72,21.94 72.42,21.94 74.22,23.74 v78.02,23.74
CAN2_RX
  Top 0.2: IC2.4 86.78,4.38 D5.2 85.02,6.14 85.02,7.47 83.62,8.87 83.62,14.49 73.62,24.49 73.62,49.67 72.67,50.62 CON3.8
  Top 0.3: CON3.8 70.77,49.87 66.85,49.87 62.52,45.54 MODULE2.39
CAN2_TX
  Top 0.2: IC2.1 86.78,8.19 D5.1 84.02,9.04 84.02,14.79 74.12,24.69 74.12,50.91 71.87,53.16 CON3.9
  Top 0.3: CON3.9 68.85,50.49 66.47,50.49 MODULE2.40
CAN2H
  Top 0.2: IC2.7 97.42,6.72 98.24,6.72 98.77,6.19 98.77,5.49 98.97,5.29 102.12,5.29 | CON14.2 107.73,4.91 CON12.2 106.4,6.24 103.02,6.24 D7.1 102.12,5.29 | SJ2.1 102.12,3.69 102.12,5.29
CAN2L
  Top 0.2: IC2.6 96.31,5.65 95.97,5.99 95.97,7.3 96.25,7.57 101.99,7.57 102.32,7.24 D7.2 R35.2 107.3,7.24 CON12.3 109.02,6.16 CON14.3
CAN_VDD  (via drill 0.3, 0.3 pad 0.6)
  Top 0.2: v100.42,30.49 100.72,30.19 100.72,28.54 D10.C v102.77,28.54 | v90.87,38.24 90.87,38.59 91.22,38.94 91.22,45.69 89.87,47.04 80.17,47.04 v79.87,46.74 | v98.87,22.39 98.87,19.39 101.42,16.84 v101.42,15.59 101.42,10.74 101.62,10.54 D9.C
  Top 0.3: R5.2 26.12,35.11 R4.2 26.05,34.84 27.22,33.67 v29.25,33.67
  Top 0.305: CON11.1 111.8,14.66 112.27,15.14 112.27,18.84 110.61,20.5 CON10.1 | D12.C 90.77,38.34 v90.87,38.24
  Top 0.5: CON13.1 108.17,19.93 108.17,16.19 109.7,14.66 CON11.1 | CON12.1 108.81,3.66 CON14.1
  Bottom 0.2: v100.42,30.49 99.37,31.54 91.67,31.54 90.87,32.34 v90.87,38.24 | v98.87,22.39 100.67,22.39 102.77,24.49 | 102.77,24.49 v102.77,28.54 | CON13.1 106.78,20.48 102.77,24.49 | v101.42,15.59 100.87,15.04 100.87,9.23 CON12.1
  Bottom 0.3: v29.25,33.67 29.25,33.31 31.42,31.14 37.62,31.14 40.02,33.54 40.02,44.84 47.07,51.89 55.22,51.89 60.27,46.84 72.52,46.84 73.07,47.39 79.07,47.39 79.72,46.74 v79.87,46.74
GAIN_OUT  (via drill 0.3 pad 0.6)
  Top 0.2: v81.92,12.94 81.86,13 CON4.5 | v86.42,13.94 88.92,13.94 90.22,15.24 93.8,15.24 LED1.C
  Top 0.3: CON4.5 69.56,13 MODULE2.25
  Bottom 0.2: v86.42,13.94 85.82,13.34 82.32,13.34 v81.92,12.94
GATE_ENABLE_OUT  (via drill 0.3 pad 0.6)
  Top 0.2: CON4.6 71.62,15.54 73.72,13.44 81.22,13.44 v81.52,13.74 | v86.92,14.64 87.22,14.34 88.72,14.34 90.02,15.64 92.5,15.64 93.6,16.74 93.6,17.34 LED2.A
  Top 0.3: CON4.6 69.02,15.54 MODULE2.26
  Bottom 0.2: v86.92,14.64 86.28,14.64 85.38,13.74 v81.52,13.74
GND  (via drill 0.3 pad 0.6)  (4 unrouted)
  Top 0.3: v30.12,21.79 28.97,21.79 C14.1 28.77,21.54 29.12,21.54 29.12,21.79 IC5.3 26.02,18.91 26.75,18.19 C16.1
  Top 0.5: MODULE2.2 46.52,44.64 43.32,47.84 38.3,47.84 CON1.8 | 114.07,51.19 114.07,59.99
  Bottom 0.3: v30.12,21.79 32.57,19.34 36.87,19.34 39.87,16.34 42.65,16.34 v42.65,15.29
  Bottom 0.5: J1.P$2 34.79,50.62 CON1.8 | 114.07,51.19 114.07,59.99
  other vias: 74.2,1.54 43.92,58.99 58.32,59.44 62.42,56.24 54.47,48.09 60.27,50.34 61.65,7.49 49.5,12.69 48.75,19.74 57.7,21.19 50.2,26.84 56.55,35.04 45.55,42.09 44.1,13.39 67.65,45.99 68.6,34.24 67.5,40.49 68.35,31.64 68.2,26.69 68.3,24.64 68.65,21.69 69.05,19.54 69.65,16.69 69.75,14.09 68.15,13.04 62.55,12.54 62.2,29.24 64.05,2.19 44.65,4.89 101.05,6.29 101.05,24.24 100.95,21.09 87.85,30.09 85.8,26.59 87.95,24.29 90.05,25.09 85.55,24.29 62.97,48.54 65.27,50.64 94.52,16.54 94.52,12.54 88.42,7.04 86.92,6.24 93.62,4.74 93.62,6.94 110.1,31.54 113.2,33.74 114.4,29.24 110.35,8.94 112.6,7.39 110.75,2.09 114.45,4.59 114.4,14.39 110.6,12.64 110.2,19.34 111.75,23.99 113.85,38.89 109.92,44.14 110.72,44.14 110.42,46.59 98.95,26.19 95.55,26.19 101.1,26.19 82.75,38.89 86.05,31.74 90.45,43.69 97.8,48.84 88.9,18.19 88,12.64 85.6,10.39 90.8,10.09 83.35,18.59 80.85,16.04 81,20.64 80.1,9.94 82.45,5.79 91.9,2.29 105.25,9.14 106.8,15.59 113,15.44 104.7,42.04 102.2,34.64 94.05,37.59 87.7,59.14 95,57.54 87.5,55.89 91.7,57.34 109.2,50.99 105.5,50.34 107.2,57.29 108.55,57.24 97.5,19.89 99.15,10.44 83.5,49.14 81,49.34 76.15,29.99 76.15,33.99 76.15,50.09 89.95,49.74 76.05,37.89 57.7,11.94
  pour Bottom (rank 3): 42.02,60.99 42.02,0.54 115.52,0.54 115.52,60.99
  pour Top (rank 5): 115.52,61.04 115.52,0.59 42.07,0.59 42.07,61.04
GPIO1  (via drill 0.3 pad 0.6)
  Top 0.2: 87.62,28.04 83.82,28.04 83.62,27.84 v83.52,27.84 | D3.6 87.62,27.34 87.62,28.04 | R6.2 89.02,28.04 87.62,28.04
  Top 0.3: MODULE2.28 67.94,20.62 CON4.8
  Bottom 0.2: v83.52,27.84 83.72,27.64 83.72,26.94 79,22.22 75.02,22.22 73.42,20.62 CON4.8
GPIO2  (via drill 0.3 pad 0.6)
  Top 0.2: 86.12,28.44 88.1,28.44 88.32,28.66 88.32,28.94 89.12,29.74 R7.2 | 86.12,28.44 86.17,28.49 D3.3 | v83.52,28.64 83.62,28.64 83.82,28.44 86.12,28.44
  Top 0.3: MODULE2.27 68.48,18.08 CON4.7
  Bottom 0.2: v83.52,28.64 83.67,28.64 84.17,28.14 84.17,26.74 79.17,21.74 75.18,21.74 CON4.7
LED_BLUE  (via drill 0.3 pad 0.6)
  Top 0.2: R10.1 102.6,48.81 102.15,48.81 101.12,47.79 101.12,44.14 97.47,40.49 v96.67,40.49
  Top 0.3: CON3.1 66.32,32.84 MODULE2.32
  Bottom 0.2: CON3.1 80.47,32.84 87.92,40.29 96.47,40.29 v96.67,40.49
LED_GREEN  (via drill 0.3 pad 0.6)
  Top 0.2: v97.27,39.89 97.57,39.89 101.52,43.84 101.52,45.84 102.32,46.64 R11.1
  Top 0.3: CON4.11 66.32,28.24 MODULE2.31
  Bottom 0.2: v97.27,39.89 88.12,39.89 80.57,32.34 74.12,32.34 72.22,30.44 72.22,28.94 CON4.11
LED_RED  (via drill 0.3 pad 0.6)
  Top 0.2: v96.67,39.29 97.57,39.29 102.02,43.74 102.02,44.24 R12.1
  Top 0.3: CON4.10 66.86,25.7 MODULE2.30
  Bottom 0.2: v96.67,39.29 96.47,39.49 88.31,39.49 80.66,31.84 74.52,31.84 72.82,30.14 72.82,27 CON4.10
MITO_PRESENCE  (via drill 0.3 pad 0.6)
  Top 0.3: 68.18,44.73 66.98,43.54 MODULE2.38 64.52,43.04 53.92,43.04 48.72,48.24 v48.42,48.24 | 68.18,44.73 CON3.7 | Q7.1 27.87,35.21 R4.1 28.35,34.74 v29.22,34.74 30.22,34.74 R31.1 | 68.18,44.73
  Bottom 0.3: v29.22,34.74 29.12,34.74 28.42,34.04 28.42,33.34 31.22,30.54 37.92,30.54 40.62,33.24 40.62,44.64 44.22,48.24 v48.42,48.24
N$1
  Top 0.3: C16.2 25.17,17.99 25.17,19.49 IC5.1 25.07,22.44 25.52,22.89 26.55,22.89 26.87,23.21 R21.2
N$2
  Top 0.3: R18.2 25.02,27.38 12.93,27.38 12.32,27.99 12.32,28.63 Q5.4
N$3
  Top 0.3: Q6.4 26.98,25.94 R19.2
N$5
  Top 0.3: 27.42,38.84 Q7.3 R32.2 | 27.42,38.84 R5.1 | Q9.1 27.42,38.84
N$6
  Top 0.3: R15.2 20.62,43.94 20.22,44.34 19.32,44.34 18.72,44.94 12.62,44.94 12.32,45.24 12.32,46.13 Q3.4
N$7
  Top 0.3: Q4.4 18.02,43.44 19.32,42.14 20.52,42.14 20.62,42.04 R16.2
N$8
  Top 0.2: R30.1 LED6.A
N$9
  Top 0.3: R29.1 Q9.3
N$10
  Top 0.3: Q1.4 12.27,11.13 12.27,10.62 13.01,9.88 24.62,9.88 R13.2
N$11
  Top 0.3: R14.2 26.33,8.44 Q2.4
N$12
  Top 0.4: CON7.3 106.12,11.45 106.12,10.69 105.97,10.54 D9.A
N$13
  Top 0.4: D10.A 105.12,28.54 107.52,30.94 CON16.3
N$14
  Top 0.2: CON5.2 110.25,38.84 109.57,38.84 109.27,38.54 109.27,38.13 CON6.2 107.51,37.19 R2.2
N$15
  Top 0.305: IC3.4 88.47,34.28 89.42,34.28 90.07,34.94 D12.A
N$16
  Top 0.4: LED4.C R9.2
N$17
  Top 0.4: LED3.C R8.2
N$18
  Top 0.2: SJ1.2 104.37,23.39 R33.1
N$20  (via drill 0.3 pad 0.6)
  Top 0.2: v98.82,27.64 99.62,26.84 108.29,26.84 109.37,27.91 CON10.2 | v92.32,27.54 91.52,27.54 R6.1
  Bottom 0.2: v98.82,27.64 98.67,27.79 92.57,27.79 v92.32,27.54
N$21
  Top 0.2: R35.1 104.57,3.14 SJ2.2
N$22  (via drill 0.35)
  Top 0.3: D4.3 30.62,43.64
  Top 0.305: v28.52,49.74 29.12,49.14 R28.1 29.32,47.44 D4.3 | 30.62,43.64 30.92,43.34 C3.2
  Bottom 0.406: v28.52,49.74 28.52,50.14 24.95,53.71 J5.4
  pour Top (no thermals): 27.62,50.94 24.52,50.94 24.52,52.89 23.82,53.59 18.92,53.59 18.92,60.69 27.62,60.69 27.62,59.94 28.02,59.54 28.52,59.54 28.52,55.54 28.02,55.54 27.52,55.04
N$24  (via drill 0.3 pad 0.6)
  Top 0.2: v98.82,28.49 99.02,28.49 100.12,27.39 105.57,27.39 106.12,27.94 106.12,28.49 107.02,29.39 109.19,29.39 109.41,29.16 CON10.3 | v92.32,28.94 91.92,28.94 91.42,29.44 91.12,29.44 R7.1
  Bottom 0.2: v98.82,28.49 98.62,28.29 92.97,28.29 v92.32,28.94
N$58
  Top 0.2: R12.2 104.32,44.74 105.12,45.54 105.12,47.39 106.07,48.34 111.67,48.34 112.72,47.29 112.72,46.59 112.92,46.39 113.87,46.39 114.02,46.54 114.02,46.99 LED5.R
N$59
  Top 0.2: R11.2 104.67,47.19 104.67,47.64 105.77,48.74 111.92,48.74 113.37,47.29 LED5.G
N$60
  Top 0.2: R10.2 112.15,49.16 112.67,48.64 LED5.B
N$76
  Top 0.2: CON5.3 110.25,39.84 108.44,39.84 CON6.3 107.79,39.19 R3.2
OCP_ADJ
  Top 0.3: CON4.9 71.47,23.21 67.75,23.21 67.17,23.79 | 67.17,23.79 65.42,25.54 MODULE2.29 | 67.17,23.79
OIUOIUIOU
  Top 0.2: IC6.1 84.87,51.54 R36.1 85.17,51.44 85.97,50.64 85.97,50.24 86.77,49.44 R34.1
PGND  (via drill 0.3 pad 0.6, 0.3 pad 1)  (2 unrouted)
  Top 0.152: R32.1 31.72,36.84 32.02,36.54
  Top 0.3: Q9.2 27.32,42.29 26.42,41.39 26.42,40.84 25.47,39.89 23.47,39.89 23.32,39.74 v23.32,39.64 | v22.57,38.89 23.65,37.81 28.6,37.81 Q7.2 29.97,36.84 R32.1 | R31.2 32.52,35.19 32.02,35.69 32.02,36.54
  Bottom 0.5: v15.77,59.34 16.22,59.34 18.22,61.34 31.47,61.34 33.42,59.39 J1.P$1
  other vias: 19.87,5.99 19.12,7.49 19.12,6.74 19.12,5.99 19.12,5.24 19.87,5.24 20.32,38.89 20.32,39.64 21.07,39.64 21.07,38.89 21.82,38.89 21.82,39.64 22.57,39.64 23.32,38.89 20.32,21.49 20.32,22.24 21.07,22.24 21.07,21.49 21.82,21.49 21.82,22.24 22.57,22.24 22.57,21.49 23.32,21.49 23.32,22.24 22.12,29.14 22.12,29.89 22.12,30.64 22.12,31.39 22.12,32.14 22.12,11.64 22.12,12.39 22.12,13.89 22.12,14.64 22.12,45.49 22.12,46.29 22.12,47.09 22.12,47.89 21.32,47.09 21.32,47.89 21.32,46.29 21.32,45.49 21.32,48.69 22.12,48.69 19.87,7.49 19.87,6.79 15.77,58.74 15.77,58.14
  pour Bottom (rank 2, no thermals): 23.47,48.86 17.42,48.86 17.42,0.54 23.47,0.54
  pour Top (no thermals): 16.72,4.44 16.72,7.69 20.12,7.69 20.12,4.44
  pour Top (no thermals): 23.57,34.54 20.12,34.54 20.12,39.89 23.57,39.89
  pour Top (no thermals): 23.57,17.44 20.17,17.44 20.17,22.54 23.57,22.54
  pour Top (no thermals): 23.52,33.34 21.62,33.34 21.62,27.94 23.52,27.94
  pour Top (no thermals): 23.57,15.94 21.62,15.94 21.62,10.39 23.57,10.39
  pour Top (no thermals): 23.52,50.59 21.02,50.59 21.02,45.19 23.52,45.19
  pour Top (rank 3, no thermals): 8.12,60.54 8.12,51.14 21.02,51.14 21.02,47.54 23.57,47.54 23.57,52.69 17.62,52.69 17.62,60.54
  pour Bottom: 15.47,59.54 16.12,59.54 16.12,57.94 15.47,57.94
PHASE_A  (via drill 0.3 pad 0.6)
  Top 0.3: v24.32,42.94 24.12,42.74 19.87,42.74 18.27,44.34 15.92,44.34 13.87,42.29 Q4.P$1 | CON1.5 35.68,42.84 38.82,42.84 R22.1 39.42,42.24 40.82,42.24 41.52,41.54 MODULE2.5
  Bottom 0.3: v24.32,42.94 35.46,42.94 CON1.5
  pour Top (no thermals): 12.52,52.14 1.52,52.1 1.52,39.04 15.52,39.04 15.52,44.04 12.52,44.04
  pour Bottom (no thermals): 8.82,50.09 8.82,37.04 1.52,37.04 1.52,50.09
PHASE_A_CURRENT_SHUNT_N  (via drill 0.3 pad 0.6)
  Top 0.3: CON2.5 35.56,12.96 36.7,12.96 39.95,16.21 39.95,17.46 MODULE2.16 | R17.S1 14.82,36.24 14.32,35.74 14.32,34.44 14.87,33.89 23.67,33.89 v24.52,33.04
  Bottom 0.3: CON2.5 34.9,13.62 33.15,13.62 26.17,20.6 26.17,32.19 25.32,33.04 v24.52,33.04
PHASE_A_CURRENT_SHUNT_P  (via drill 0.3 pad 0.6)
  Top 0.3: CON2.4 35.52,10.96 40.45,15.88 40.45,16.91 41.07,17.54 MODULE2.17 | R17.S2 23.72,36.24 24.02,35.94 24.02,35.04 v25.02,34.04
  Bottom 0.3: CON2.4 35.52,10.93 36.92,12.33 36.92,13.54 36.25,14.21 33.35,14.21 26.7,20.86 26.7,32.51 25.17,34.04 v25.02,34.04
PHASE_A_GATE_HIGH  (via drill 0.3 pad 0.6)
  Top 0.3: R15.1 24.07,43.84 v24.37,44.14 | CON1.6 36.22,44.84 38.82,44.84 R22.2 39.42,44.24 41.32,44.24 MODULE2.4
  Bottom 0.3: v24.37,44.14 34.12,44.14 CON1.6
PHASE_A_GATE_LOW  (via drill 0.3 pad 0.6)
  Top 0.3: R16.1 22.82,41.84 v24.02,41.84 | CON1.4 35.74,40.24 38.82,40.24 R23.2 39.42,40.24 41.32,40.24 MODULE2.6
  Bottom 0.3: v24.02,41.84 34.14,41.84 CON1.4
PHASE_A_GND  (via drill 0.3 pad 0.6)
  Top 0.3: Q4.2 17.12,40.64 17.22,40.54 23.92,40.54 v24.02,40.64 | 39.12,38.24 41.32,38.24 MODULE2.7 | 39.12,38.24 R23.1 | CON1.3 35.84,38.24 39.12,38.24
  Bottom 0.3: v24.02,40.64 32.8,40.64 CON1.3
  pour Top (no thermals): 16.52,42.39 19.52,42.39 19.52,34.54 16.52,34.54
PHASE_B
  Top 0.3: Q6.5 12.72,26.74 26.12,26.74 28.57,29.19 | 28.57,29.19 30.8,31.41 34.1,31.41 CON1.1 36.22,33.54 MODULE2.9 | 28.57,29.19 27.08,30.68 25.67,30.68 R25.1
  pour Top (no thermals): 12.52,35.54 1.52,35.54 1.52,21.54 15.52,21.54 15.52,26.54 12.52,26.54
  pour Bottom (no thermals): 8.82,35.54 8.82,22.04 1.52,22.04 1.52,35.54
PHASE_B_CURRENT_SHUNT_N  (via drill 0.3 pad 0.6)
  Top 0.3: CON2.3 36.51,7.92 44.52,15.93 MODULE2.18 | R20.S1 14.77,19.09 14.37,18.69 14.37,17.24 14.87,16.74 23.5,16.74 24.7,15.54 v25.02,15.54
  Bottom 0.3: CON2.3 34.82,8.62 31.49,8.62 25.02,15.09 v25.02,15.54
PHASE_B_CURRENT_SHUNT_P  (via drill 0.3 pad 0.6)
  Top 0.3: CON2.2 35.52,5.94 44.77,15.19 45.17,15.19 MODULE2.19 | R20.S2 23.8,19.09 24.07,18.81 24.07,17.26 24.8,16.54 v25.52,16.54
  Bottom 0.3: CON2.2 35.52,6.01 36.87,7.36 36.87,8.49 36.17,9.19 31.7,9.19 25.72,15.16 25.72,16.34 v25.52,16.54
PHASE_B_GATE_HIGH
  Top 0.3: R25.2 27.03,32.19 R18.1 30.26,32.63 32.77,32.63 CON1.2 35.68,35.54 MODULE2.8
PHASE_B_GATE_LOW
  Top 0.3: R19.1 R24.2 31.69,27.64 34.92,27.64 CON2.11 38.82,31.54 MODULE2.10
PHASE_B_GND
  Top 0.3: Q6.2 17.12,23.8 18.16,24.84 28.67,24.84 R24.1 30.32,26.17 35.05,26.17 CON2.10 39.36,29.54 MODULE2.11
  pour Top (no thermals): 16.52,25.04 19.52,25.04 19.52,17.04 16.52,17.04
PHASE_C  (13 unrouted)
  Top 0.3: 28.32,12.04 32.52,16.24 32.52,17.62 CON2.8 40.44,25.54 MODULE2.13 | 28.32,12.04 25.52,9.24 15.92,9.24 13.87,7.19 Q2.P$1 | R27.1 25.52,13.43 26.93,13.43 28.32,12.04
  pour Top (no thermals): 1.52,19.54 1.52,7.54 6.02,7.54 9.52,4.04 15.52,4.04 15.47,7.54 15.47,8.84 12.52,8.84 12.52,19.54
  pour Bottom (no thermals): 8.82,20.34 8.82,4.74 6.02,7.54 1.52,7.54 1.52,20.34
PHASE_C_GATE_HIGH
  Top 0.3: R27.2 28.24,13.53 R13.1 31.52,16.8 31.52,19.14 35.52,23.14 CON2.9 39.9,27.54 MODULE2.12
PHASE_C_GATE_LOW
  Top 0.3: R26.2 R14.1 29.83,12.38 CON2.7 40.98,23.54 MODULE2.14
PHASE_C_GND
  Top 0.3: S1.IN 20.77,6.79 21.27,7.29 27.27,7.29 29.42,9.43 29.52,9.43 R26.1 29.92,9.03 31.42,9.03 32.87,10.49 32.87,12.89 CON2.6 41.52,21.54 MODULE2.15
PWREN_IN
  Top 0.3: CON4.1 71.22,2.54 65.22,2.54 63.52,4.24 63.52,9.54 MODULE2.21
SFGKDLS
  Top 0.3: R29.2 26.92,47.84 R28.2 D4.1 27.17,45.89 28.22,44.84 28.22,44.04 28.62,43.64 28.62,42.44 C3.1
  Top 0.305: R28.2 27.12,51.21 Q8.4
SWCLK  (via drill 0.3 pad 0.6)
  Top 0.2: CON6.5 107.92,43.84 109.52,42.24 110.25,42.24 CON5.5 | v90.92,47.94 90.72,48.14 80.17,48.14 v79.87,48.44
  Bottom 0.2: CON6.5 94.46,44.4 v90.92,47.94 | v79.87,48.44 73.17,48.44 72.27,49.34 70.97,49.34 68.87,51.44 64.02,51.44 57.72,57.74 37.56,57.74 CON1.10
SWDIO  (via drill 0.3 pad 0.6)
  Top 0.2: CON5.4 110.25,41.24 108.54,41.24 CON6.4 | v79.87,47.59 90.32,47.59 v90.92,46.99
  Bottom 0.2: CON6.4 105.84,43.94 94.27,43.94 91.22,46.99 v90.92,46.99 | v79.87,47.59 79.97,47.59 80.52,48.14 80.52,48.69 77.32,51.89 64.32,51.89 57.97,58.24 CON1.11
TEMPERATURE_SENSOR  (via drill 0.3 pad 0.6)
  Top 0.3: IC5.2 C14.2 v30.17,19.59 | CON2.1 36.22,2.14 41.52,2.14 43.45,4.06 43.45,11.46 MODULE2.20
  Bottom 0.3: v30.17,19.59 32.92,16.84 36.12,16.84 37.6,15.36 37.6,4.91 CON2.1
UART_RX  (via drill 0.3 pad 0.6)
  Top 0.2: v94.22,21.84 94.22,35.21 97.65,38.64 102.12,38.64 102.32,38.84 R3.1
  Top 0.3: CON4.3 70.94,7.92 63.67,15.19 61.87,15.19 MODULE2.23
  Bottom 0.2: CON4.3 84.6,7.92 93.32,16.64 93.32,20.44 94.02,21.14 94.02,21.64 v94.22,21.84
UART_TX  (via drill 0.3 pad 0.6)
  Top 0.2: v94.77,21.24 94.77,21.34 94.87,21.44 94.87,22.19 94.67,22.39 94.67,35.04 96.82,37.19 R2.1
  Top 0.3: CON4.2 70.22,6.68 70.22,7.47 63.16,14.54 60.52,14.54 MODULE2.22
  Bottom 0.2: CON4.2 73.58,7.44 84.82,7.44 93.72,16.34 93.72,20.19 v94.77,21.24
USB+  (via drill 0.35)
  Top 0.2: D1.3 106.27,54.84 109.12,54.84 109.52,55.24 110.22,55.24 110.42,55.44 CON8.D+
  Top 0.203: D1.3 103.37,54.09 v102.47,54.99
  Top 0.3: CON3.4 68.6,37.54 MODULE2.35
  Bottom 0.2: CON3.4 72.57,39.41 77.14,39.41 90.78,53.05 96.53,53.05
  Bottom 0.203: 96.53,53.05 99.92,56.44 99.92,56.84 | 99.92,56.84 CON9.3 | v102.47,54.99 100.62,56.84 99.92,56.84
USB-  (via drill 0.3 pad 0.6)
  Top 0.2: v109.72,54.54 109.97,54.79 CON8.D- | v109.72,55.84 109.56,55.84 108.96,55.24 106.27,55.24 D1.2 101.49,55.99 CON9.2
  Top 0.3: CON3.3 69.77,37.92 68.84,36.99 66.47,36.99 MODULE2.34
  Bottom 0.2: CON3.3 72.54,38.94 77.32,38.94 91.02,52.64 96.69,52.64 98.47,54.42 CON9.2 | v109.72,54.54 v109.72,55.84
USB_VBUS  (via drill 0.3 pad 0.6)
  Top 0.4: D1.4 107.62,53.99 107.62,52.44 D2.A 108.82,52.44 110.52,54.14 CON8.VBUS
  Top 0.406: v106.67,54.09 D1.4 | R1.1 96.76,51.88 CON9.1
  Bottom 0.406: v106.67,54.09 104.46,51.88 CON9.1
VDC  (via drill 0.3, 0.3 pad 0.6)
  Top 0.5: MODULE2.3 42.48,46.58 37.02,46.58 CON1.7 32.07,48.08 v32.07,48.34
  other vias: 15.52,49.54 15.52,48.79 15.52,48.04 15.52,47.29 15.52,46.54 15.52,45.79 15.27,14.54 15.27,13.79 15.27,13.04 15.27,12.29 15.27,11.54 15.27,10.79 15.27,32.04 15.27,31.29 15.27,30.54 15.27,29.79 15.27,29.04 15.27,28.29 30.47,48.34 31.27,48.34 31.27,45.14 32.07,45.14 30.47,45.94 31.27,45.94 32.07,45.94 30.47,46.74 31.27,46.74 32.07,46.74 30.47,47.54 31.27,47.54 32.07,47.54 32.87,48.34 32.87,45.14 32.87,45.94 32.87,46.74 32.87,47.54 28.52,53.34 28.52,52.74 28.52,52.14 28.52,51.54 29.12,51.54 29.12,52.14 29.12,52.74 29.12,53.34 29.72,53.34 29.72,52.74 29.72,52.14 29.72,51.54
  pour Bottom (no thermals): 16.22,50.64 10.52,50.64 10.52,0.54 16.22,0.54
  pour Top (no thermals): 20.32,50.34 15.02,50.34 15.02,45.74 20.32,45.74
  pour Top (no thermals): 20.27,32.84 15.02,32.84 15.02,28.14 20.27,28.14
  pour Top (no thermals): 20.27,15.39 15.02,15.39 15.02,10.74 20.27,10.74
  pour Top (no thermals): 29.57,59.54 33.62,59.54 33.62,44.16 29.57,44.16 29.62,50.94 28.32,50.94 28.32,53.64 29.52,53.64 29.57,53.69
  pour Bottom: 33.12,44.84 28.52,44.84 23.57,49.79 10.52,49.79 10.52,52.44 25.82,52.44 27.97,50.18 27.92,49.34 27.92,49.04 33.12,49.04
VDD_5V  (via drill 0.3 pad 0.6, 0.35)
  Top 0.2: C5.2 81,51.16 IC6.2 81.37,53.39 | R34.2 86.97,53.39 | CON5.1 109.77,38.04 109.77,36.09 CON6.1
  Top 0.3: R21.1 v30.02,23.39
  Top 0.4: C2.2 89.71,5.65 IC2.3 94.42,5.65 | IC1.3 92.01,23.84 93.42,23.84 93.67,24.09 93.67,30.74 93.67,30.94 | IC2.5 95.69,4.38 94.42,5.65 | LED1.A 96.12,15.54 | 96.12,15.54 96.12,12.61 95.25,11.74 LED3.A 95.25,9.54 94.42,8.71 94.42,5.65 | 96.12,15.54 96.12,18.46 95.25,19.34 LED4.A 95.25,20.46 96.22,21.44 96.22,22.38 IC1.5 | D3.5 v86.92,26.44 | D3.2 v86.92,30.04 86.92,30.34 88.27,31.69 92.17,31.69
  Top 0.406: IC3.3 87.27,32.89 91.72,32.89 | 91.72,32.89 92.47,32.89 | 92.17,33.19 92.6,32.76 | 92.6,32.76 92.8,32.56 92.8,32.31 | 92.95,32.51 92.6,32.86 92.6,32.76 | 92.95,32.51 93.15,32.31 | 92.17,31.69 92.8,32.31 | 92.8,32.31 92.95,32.46 | 92.95,32.51 92.95,32.46 | 91.72,32.89 91.72,34.09 91.82,34.19 | 92.95,32.46 93.1,32.31 93.15,32.31 | 93.67,30.74 93.67,31.79 93.15,32.31
  Top 0.5: CON1.9 39.64,49.04 43.32,49.04 46.42,45.94 47.12,45.94 MODULE2.1 | 92.47,32.89 92.17,33.19 91.82,33.54 91.82,34.19 91.82,49.94 | 91.82,49.94 88.37,53.39 86.97,53.39 81.37,53.39 80.57,53.39 74.17,59.79 62.32,59.79 52.34,49.8 v51.92,49.8 | 91.82,49.94 100.52,49.94 103.02,52.44 D2.C 105.22,52.44 107.72,49.94 v111.92,49.94 113.62,49.94 114.22,49.34 LED5.+ | D11.4 51.62,50.47 51.49,50.33 v51.49,50.23
  Bottom 0.2: v86.92,26.44 v86.92,30.04
  Bottom 0.3: CON1.9 36.98,51.7 36.98,37.3 36.36,36.68 29.36,36.68 27.62,34.94 27.62,32.64 30.02,30.24 v30.02,23.39
  Bottom 0.406: v111.92,49.94 111.92,38.24 CON6.1
  Bottom 0.5: v51.92,49.8 52.61,49.12 48.52,45.04 MODULE2.1
  Bottom 0.6: v89.82,23.64 v90.42,23.64 95.12,23.64 v97.22,21.54 v97.82,21.54
  other vias: 52.35,49.37
  pour Top (no thermals): 50.73,50.5 51.79,51.56 53.34,50.01 52.28,48.95
  pour Bottom (no thermals): 52.43,48.8 52.89,49.26 51.59,50.56 51.13,50.1
  pour Top (no thermals): 96.12,22.64 96.12,21.34 98.12,21.34 98.12,22.64
  pour Top (no thermals): 88.62,23.94 88.62,23.34 92.92,23.34 92.92,23.94
VUSB  (via drill 0.35)
  Top 0.406: MODULE2.33 66.86,35.38 CON3.2 | v93.32,51.49 93.37,51.54 R1.2
  Bottom 0.406: v93.32,51.49 77.21,35.38 CON3.2

### Text on the board
tPlace: + | - | 1 | 40 | PHASE A | AUX | PHASE B | CAN1 | CAN1 | T1 | GATE_EN | GAIN | PHASE C | 20 | 21 | BEC_EN | CAN2 | Mitochondrik / Evaluation / Board-LV | CAN2 | BULK CAP | V1.2 | T2 | + | -